# Altium project NeoLink Basic Main Board.PrjPcb (part 1 of 2)
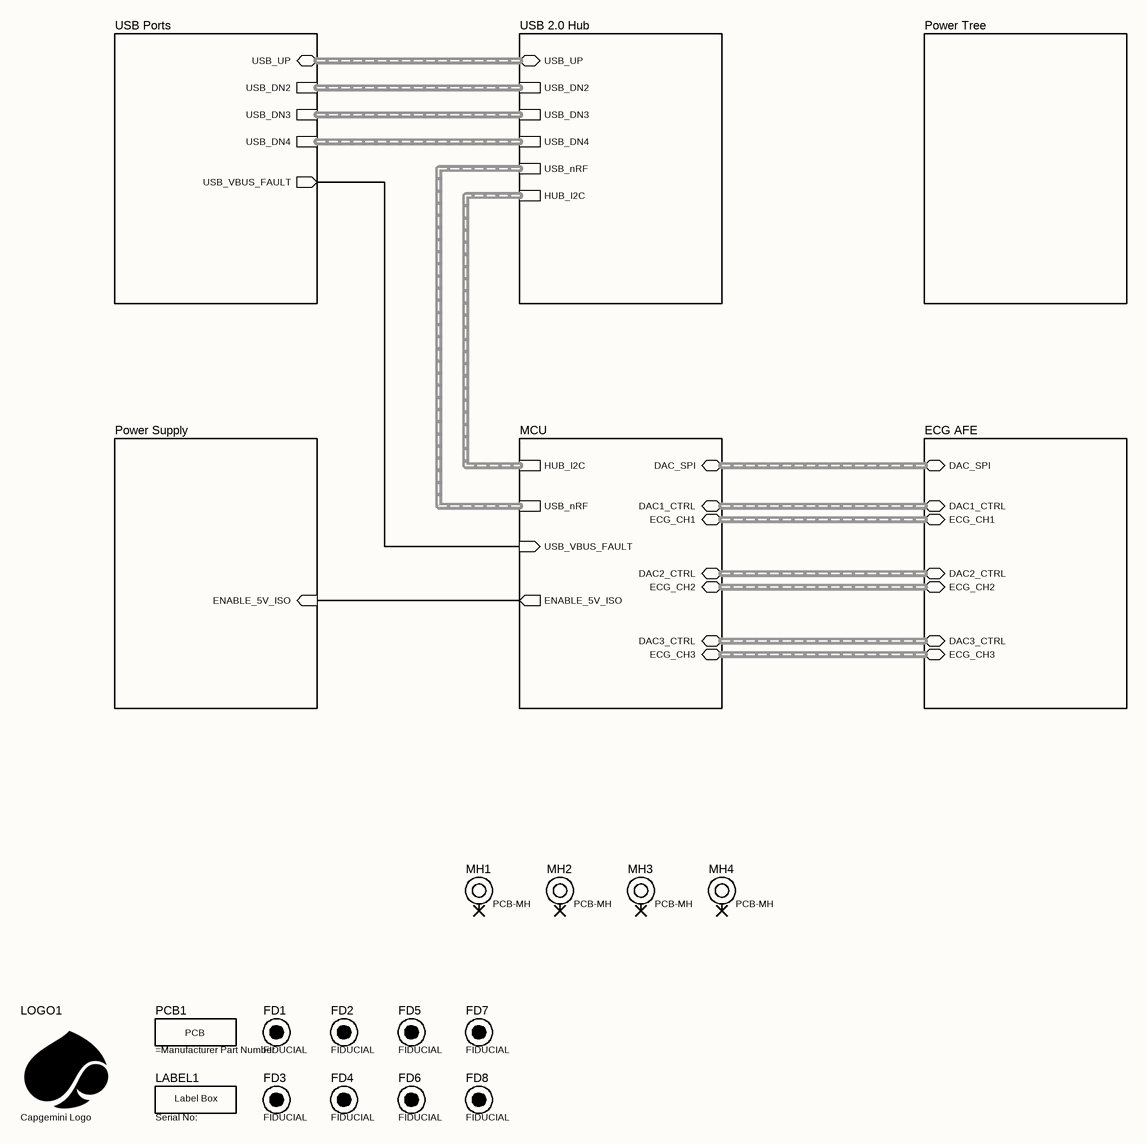
[diagram p0: NeoLink Basic Main Board - Top Level.SchDoc]
AuthorInitials: ASH; CGProjectName: NeoLink Basic; ClientName: VITALTRACE PTY LTD; PCBANo: 7001; PCBARev: 05; PCBNo: 7000; PCBRev: 05; ProjectCode: VIT-2679; ProjectTitle: NeoLink Basic Main Board
8 sheets, 468 parts. Net scope: hierarchical (ports join the sheet entries above them; power ports are global).
Board file: NeoLink Basic Main Board.PcbDoc
Sheets:
  NeoLink Basic Main Board - Top Level.SchDoc
    USB 2.0 Hub = USB 2.0 Hub.SchDoc
    Power Supply = Power Supply.SchDoc
    USB Ports = USB Ports.SchDoc
    MCU = MCU.SchDoc
    ECG AFE = ECG AFE.SchDoc
      A = AFE Channel.SchDoc
      B = AFE Channel.SchDoc
      C = AFE Channel.SchDoc
    Power Tree = Power Tree.SchDoc

## Sheet NeoLink Basic Main Board - Top Level.SchDoc: Top Level
size A3; DocumentNumber: 1; SheetNumber: 1; SheetTotal: 9

### Parts
FD1  FIDUCIAL  [FIDUCIAL-1MM]  (no BOM)
FD2  FIDUCIAL  [FIDUCIAL-1MM]  (no BOM)
FD3  FIDUCIAL  [FIDUCIAL-1MM]  (no BOM)
FD4  FIDUCIAL  [FIDUCIAL-1MM]  (no BOM)
FD5  FIDUCIAL  [FIDUCIAL-1MM]  (no BOM)
FD6  FIDUCIAL  [FIDUCIAL-1MM]  (no BOM)
FD7  FIDUCIAL  [FIDUCIAL-1MM]  (no BOM)
FD8  FIDUCIAL  [FIDUCIAL-1MM]  (no BOM)
LABEL1  Serial No:  [Label Box, Rectangle, 6mm x 20mm]  (no BOM)
LOGO1  Capgemini Logo  [Capgemini Copper Logo - Large]  (no BOM)
MH1  PCB-MH  [PCB-MH-M3-LF-PH]  (no BOM)
MH2  PCB-MH  [PCB-MH-M3-LF-PH]  (no BOM)
MH3  PCB-MH  [PCB-MH-M3-LF-PH]  (no BOM)
MH4  PCB-MH  [PCB-MH-M3-LF-PH]  (no BOM)
PCB1  (no value)  (mechanical)

### Sub-sheets
ECG AFE = ECG AFE.SchDoc: DAC_SPI (bidir, harness DAC_SPI), DAC1_CTRL (bidir, harness DAC_SPI), DAC2_CTRL (bidir, harness DAC_SPI), DAC3_CTRL (bidir, harness DAC_SPI), ECG_CH1 (bidir, harness ECG_CH1), ECG_CH2 (bidir, harness ECG_CH1), ECG_CH3 (bidir, harness ECG_CH1)
MCU = MCU.SchDoc: DAC_SPI (bidir, harness DAC_SPI), DAC1_CTRL (bidir, harness DAC_SPI), DAC2_CTRL (bidir, harness DAC_SPI), DAC3_CTRL (bidir, harness DAC_SPI), ECG_CH1 (bidir, harness ECG_CH1), ECG_CH2 (bidir, harness ECG_CH1), ECG_CH3 (bidir, harness ECG_CH1), USB_nRF (harness USB_nRF), HUB_I2C (harness HUB_I2C), USB_VBUS_FAULT (in), ENABLE_5V_ISO (out)
Power Supply = Power Supply.SchDoc: ENABLE_5V_ISO (in)
Power Tree = Power Tree.SchDoc: no entries
USB 2.0 Hub = USB 2.0 Hub.SchDoc: USB_DN2 (harness USB_DN2), USB_DN3 (harness USB_DN3), USB_DN4 (harness USB_DN4), USB_UP (bidir, harness USB_UP), USB_nRF (harness USB_nRF), HUB_I2C (harness HUB_I2C)
USB Ports = USB Ports.SchDoc: USB_DN2 (harness USB_DN2), USB_DN3 (harness USB_DN3), USB_DN4 (harness USB_DN4), USB_UP (bidir, harness USB_UP), USB_VBUS_FAULT (out)

### Nets
ENABLE_5V_ISO: sheet Power Supply/ENABLE_5V_ISO, sheet MCU/ENABLE_5V_ISO
USB_VBUS_FAULT: sheet USB Ports/USB_VBUS_FAULT, sheet MCU/USB_VBUS_FAULT

Not connected (* = marked no-connect by the designer): MH1 MH*; MH2 MH*; MH3 MH*; MH4 MH*

### Buses and harness runs
harness sheet ECG AFE/DAC1_CTRL = sheet MCU/DAC1_CTRL
harness sheet ECG AFE/DAC2_CTRL = sheet MCU/DAC2_CTRL
harness sheet ECG AFE/DAC3_CTRL = sheet MCU/DAC3_CTRL
harness sheet ECG AFE/DAC_SPI = sheet MCU/DAC_SPI
harness sheet ECG AFE/ECG_CH1 = sheet MCU/ECG_CH1
harness sheet ECG AFE/ECG_CH2 = sheet MCU/ECG_CH2
harness sheet ECG AFE/ECG_CH3 = sheet MCU/ECG_CH3
harness sheet MCU/HUB_I2C = sheet USB 2.0 Hub/HUB_I2C
harness sheet MCU/USB_nRF = sheet USB 2.0 Hub/USB_nRF
harness sheet USB 2.0 Hub/USB_DN2 = sheet USB Ports/USB_DN2
harness sheet USB 2.0 Hub/USB_DN3 = sheet USB Ports/USB_DN3
harness sheet USB 2.0 Hub/USB_DN4 = sheet USB Ports/USB_DN4
harness sheet USB 2.0 Hub/USB_UP = sheet USB Ports/USB_UP

### Notes on the sheet
- COMMERCIAL IN CONFIDENCE
- CLIENT
- THIS DOCUMENT IS UNCONTROLLED WHEN PRINTED
- PROJECT
- PART NAME
- TITLE
- SHEET SIZE
- SHEET
- DATE
- A3
- FILE
- PROJECT CODE
- PART / DWG No.
- REV
- VARIANT
- AUTHOR
- (in symbol CMP-0000003197-1) PCB

### Library data of the parts
FD1-FD8 = CMP-0000000671-3
LABEL1 = CMP-0000002854-5: Manufacturer: N/A; Manufacturer Part Number: N/A
LOGO1 = CMP-0000003196-9: Manufacturer: N/A; Manufacturer Part Number: N/A
MH1-MH4 = CMP-0000002988-3
PCB1 = CMP-0000003197-1: Capgemini PCB BOM Component; Manufacturer Part Number: VIT-2679-7000-05; Manufacturer: VITALTRACE PTY LTD

## Sheet USB 2.0 Hub.SchDoc: USB 2.0 Hub
size A2; DocumentNumber: 5; SheetNumber: 5; SheetTotal: 9
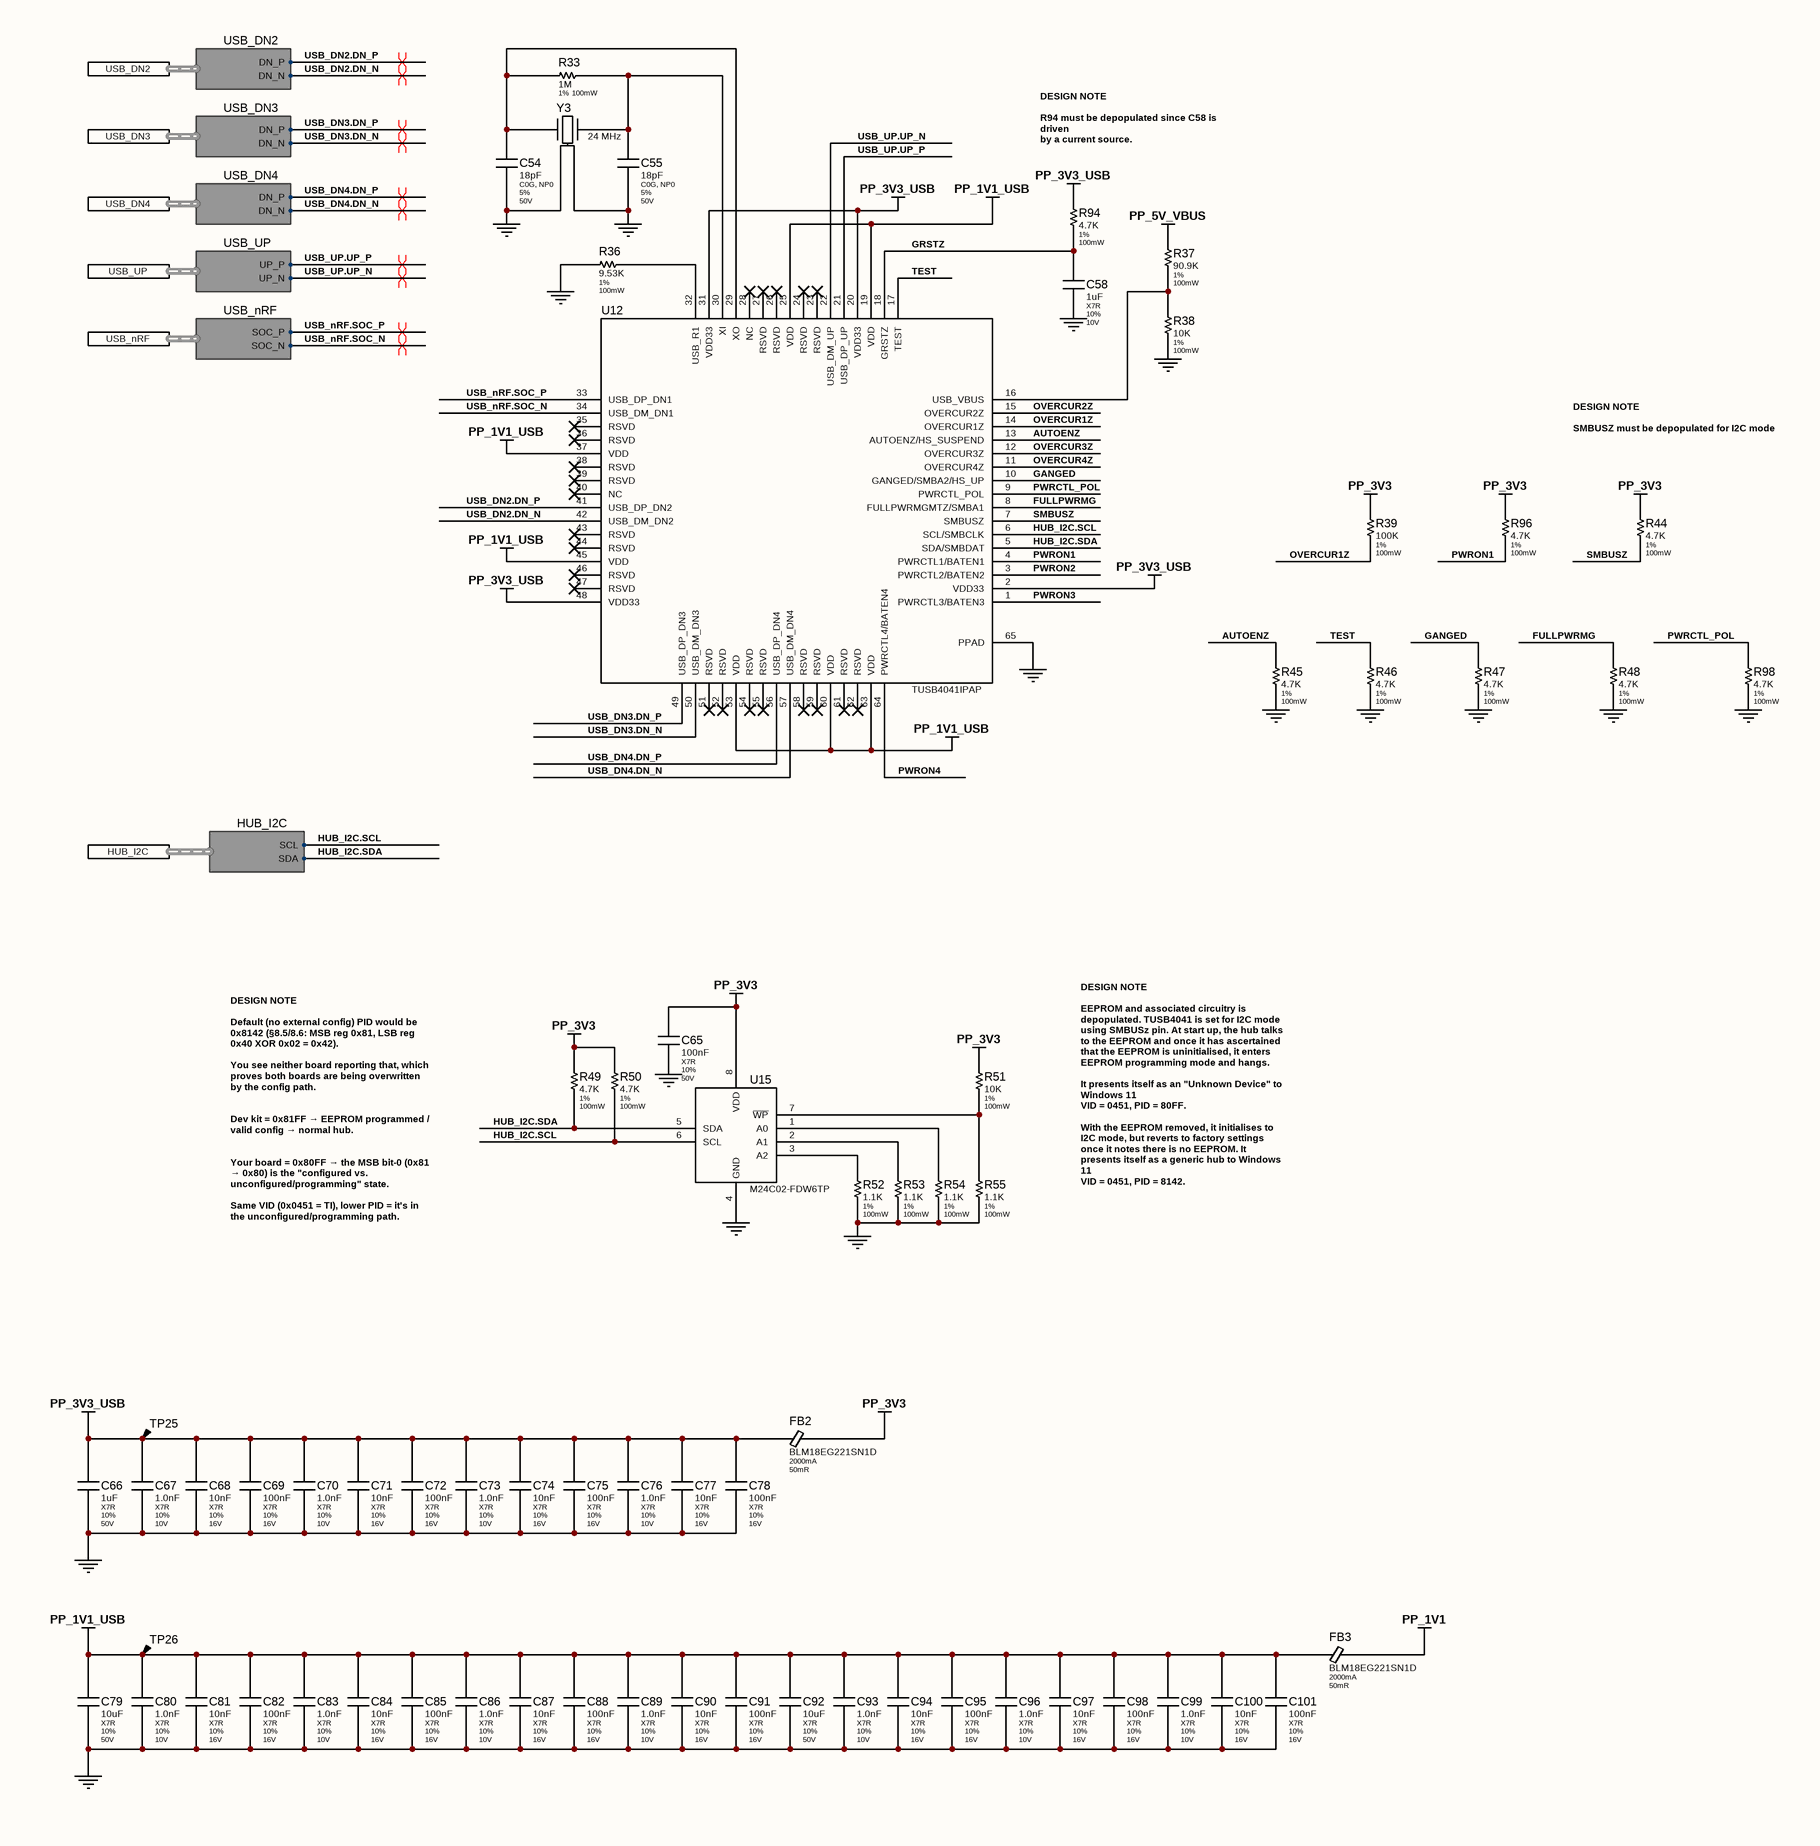
[diagram p1: USB 2.0 Hub.SchDoc, left]
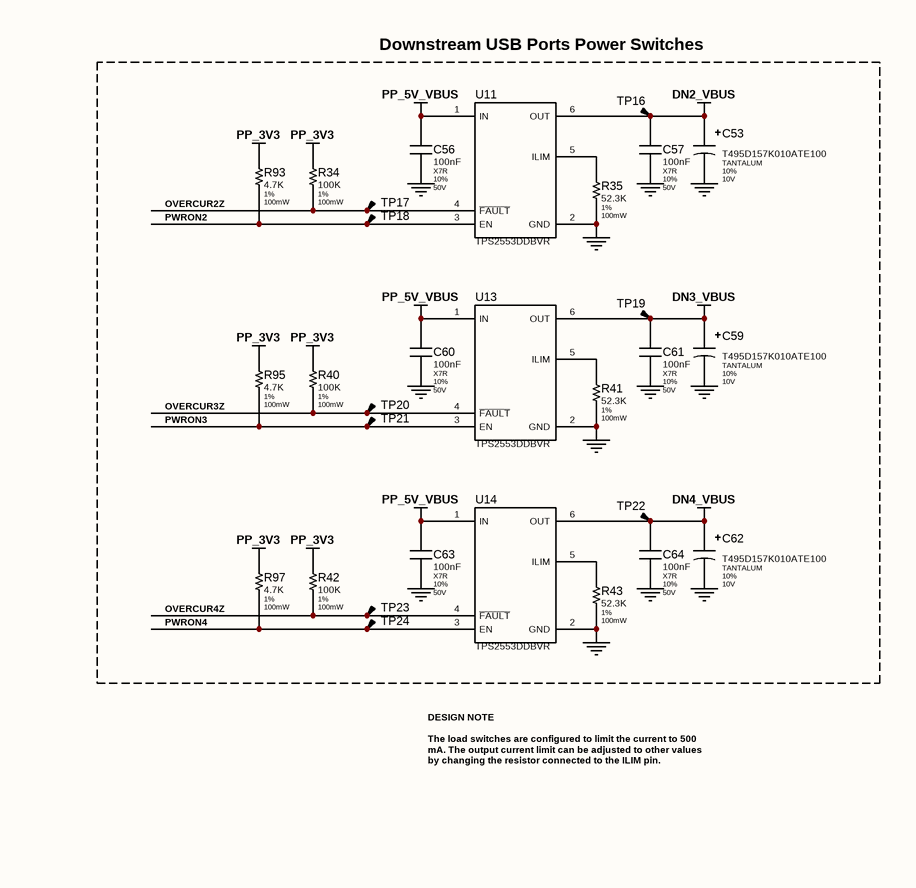
[diagram p2: USB 2.0 Hub.SchDoc, right]

### Parts
C53  T495D157K010ATE100  Type: TANTALUM  Tolerance: 10%  Voltage: 10V  [T495D]
C54  18pF  Dielectric: C0G, NP0  Tolerance: 5%  Voltage: 50V  [MLCC-0402-N]
C55  18pF  Dielectric: C0G, NP0  Tolerance: 5%  Voltage: 50V  [MLCC-0402-N]
C56  100nF  Dielectric: X7R  Tolerance: 10%  Voltage: 50V  [MLCC-0402-N]
C57  100nF  Dielectric: X7R  Tolerance: 10%  Voltage: 50V  [MLCC-0402-N]
C58  1uF  Dielectric: X7R  Tolerance: 10%  Voltage: 10V  [MLCC-0402-N]
C59  T495D157K010ATE100  Type: TANTALUM  Tolerance: 10%  Voltage: 10V  [T495D]
C60  100nF  Dielectric: X7R  Tolerance: 10%  Voltage: 50V  [MLCC-0402-N]
C61  100nF  Dielectric: X7R  Tolerance: 10%  Voltage: 50V  [MLCC-0402-N]
C62  T495D157K010ATE100  Type: TANTALUM  Tolerance: 10%  Voltage: 10V  [T495D]
C63  100nF  Dielectric: X7R  Tolerance: 10%  Voltage: 50V  [MLCC-0402-N]
C64  100nF  Dielectric: X7R  Tolerance: 10%  Voltage: 50V  [MLCC-0402-N]
C65  100nF  Dielectric: X7R  Tolerance: 10%  Voltage: 50V  [MLCC-0402-N]
C66  1uF  Dielectric: X7R  Tolerance: 10%  Voltage: 50V  [MLCC-0805-N]
C67  1.0nF  Dielectric: X7R  Tolerance: 10%  Voltage: 10V  [MLCC-0201-N]
C68  10nF  Dielectric: X7R  Tolerance: 10%  Voltage: 16V  [MLCC-0201-N]
C69  100nF  Dielectric: X7R  Tolerance: 10%  Voltage: 16V  [MLCC-0201-N]
C70  1.0nF  Dielectric: X7R  Tolerance: 10%  Voltage: 10V  [MLCC-0201-N]
C71  10nF  Dielectric: X7R  Tolerance: 10%  Voltage: 16V  [MLCC-0201-N]
C72  100nF  Dielectric: X7R  Tolerance: 10%  Voltage: 16V  [MLCC-0201-N]
C73  1.0nF  Dielectric: X7R  Tolerance: 10%  Voltage: 10V  [MLCC-0201-N]
C74  10nF  Dielectric: X7R  Tolerance: 10%  Voltage: 16V  [MLCC-0201-N]
C75  100nF  Dielectric: X7R  Tolerance: 10%  Voltage: 16V  [MLCC-0201-N]
C76  1.0nF  Dielectric: X7R  Tolerance: 10%  Voltage: 10V  [MLCC-0201-N]
C77  10nF  Dielectric: X7R  Tolerance: 10%  Voltage: 16V  [MLCC-0201-N]
C78  100nF  Dielectric: X7R  Tolerance: 10%  Voltage: 16V  [MLCC-0201-N]
C79  10uF  Dielectric: X7R  Tolerance: 10%  Voltage: 50V  [MLCC-1206-N]
C80  1.0nF  Dielectric: X7R  Tolerance: 10%  Voltage: 10V  [MLCC-0201-N]
C81  10nF  Dielectric: X7R  Tolerance: 10%  Voltage: 16V  [MLCC-0201-N]
C82  100nF  Dielectric: X7R  Tolerance: 10%  Voltage: 16V  [MLCC-0201-N]
C83  1.0nF  Dielectric: X7R  Tolerance: 10%  Voltage: 10V  [MLCC-0201-N]
C84  10nF  Dielectric: X7R  Tolerance: 10%  Voltage: 16V  [MLCC-0201-N]
C85  100nF  Dielectric: X7R  Tolerance: 10%  Voltage: 16V  [MLCC-0201-N]
C86  1.0nF  Dielectric: X7R  Tolerance: 10%  Voltage: 10V  [MLCC-0201-N]
C87  10nF  Dielectric: X7R  Tolerance: 10%  Voltage: 16V  [MLCC-0201-N]
C88  100nF  Dielectric: X7R  Tolerance: 10%  Voltage: 16V  [MLCC-0201-N]
C89  1.0nF  Dielectric: X7R  Tolerance: 10%  Voltage: 10V  [MLCC-0201-N]
C90  10nF  Dielectric: X7R  Tolerance: 10%  Voltage: 16V  [MLCC-0201-N]
C91  100nF  Dielectric: X7R  Tolerance: 10%  Voltage: 16V  [MLCC-0201-N]
C92  10uF  Dielectric: X7R  Tolerance: 10%  Voltage: 50V  [MLCC-1206-N]
C93  1.0nF  Dielectric: X7R  Tolerance: 10%  Voltage: 10V  [MLCC-0201-N]
C94  10nF  Dielectric: X7R  Tolerance: 10%  Voltage: 16V  [MLCC-0201-N]
C95  100nF  Dielectric: X7R  Tolerance: 10%  Voltage: 16V  [MLCC-0201-N]
C96  1.0nF  Dielectric: X7R  Tolerance: 10%  Voltage: 10V  [MLCC-0201-N]
C97  10nF  Dielectric: X7R  Tolerance: 10%  Voltage: 16V  [MLCC-0201-N]
C98  100nF  Dielectric: X7R  Tolerance: 10%  Voltage: 16V  [MLCC-0201-N]
C99  1.0nF  Dielectric: X7R  Tolerance: 10%  Voltage: 10V  [MLCC-0201-N]
C100  10nF  Dielectric: X7R  Tolerance: 10%  Voltage: 16V  [MLCC-0201-N]
C101  100nF  Dielectric: X7R  Tolerance: 10%  Voltage: 16V  [MLCC-0201-N]
FB2  BLM18EG221SN1D  Current: 2000mA  ESR: 50mR  [FB-0603-N]
FB3  BLM18EG221SN1D  Current: 2000mA  ESR: 50mR  [FB-0603-N]
R33  1M  Tolerance: 1%  Power: 100mW  [RES-0402-N]
R34  100K  Tolerance: 1%  Power: 100mW  [RES-0402-N]
R35  52.3K  Tolerance: 1%  Power: 100mW  [RES-0402-N]
R36  9.53K  Tolerance: 1%  Power: 100mW  [RES-0402-N]
R37  90.9K  Tolerance: 1%  Power: 100mW  [RES-0402-N]
R38  10K  Tolerance: 1%  Power: 100mW  [RES-0402-N]
R39  100K  Tolerance: 1%  Power: 100mW  [RES-0402-N]
R40  100K  Tolerance: 1%  Power: 100mW  [RES-0402-N]
R41  52.3K  Tolerance: 1%  Power: 100mW  [RES-0402-N]
R42  100K  Tolerance: 1%  Power: 100mW  [RES-0402-N]
R43  52.3K  Tolerance: 1%  Power: 100mW  [RES-0402-N]
R44  4.7K  Tolerance: 1%  Power: 100mW  [RES-0402-N]
R45  4.7K  Tolerance: 1%  Power: 100mW  [RES-0402-N]
R46  4.7K  Tolerance: 1%  Power: 100mW  [RES-0402-N]
R47  4.7K  Tolerance: 1%  Power: 100mW  [RES-0402-N]
R48  4.7K  Tolerance: 1%  Power: 100mW  [RES-0402-N]
R49  4.7K  Tolerance: 1%  Power: 100mW  [RES-0402-N]
R50  4.7K  Tolerance: 1%  Power: 100mW  [RES-0402-N]
R51  10K  Tolerance: 1%  Power: 100mW  [RES-0402-N]
R52  1.1K  Tolerance: 1%  Power: 100mW  [RES-0402-N]
R53  1.1K  Tolerance: 1%  Power: 100mW  [RES-0402-N]
R54  1.1K  Tolerance: 1%  Power: 100mW  [RES-0402-N]
R55  1.1K  Tolerance: 1%  Power: 100mW  [RES-0402-N]  (no BOM)
R93  4.7K  Tolerance: 1%  Power: 100mW  [RES-0402-N]
R94  4.7K  Tolerance: 1%  Power: 100mW  [RES-0402-N]  (no BOM)
R95  4.7K  Tolerance: 1%  Power: 100mW  [RES-0402-N]
R96  4.7K  Tolerance: 1%  Power: 100mW  [RES-0402-N]
R97  4.7K  Tolerance: 1%  Power: 100mW  [RES-0402-N]
R98  4.7K  Tolerance: 1%  Power: 100mW  [RES-0402-N]  (no BOM)
TP16  TP-SMT-CIRCLE  [TP-1.0mm]  (value not drawn)  (no BOM)
TP17  TP-SMT-CIRCLE  [TP-1.0mm]  (value not drawn)  (no BOM)
TP18  TP-SMT-CIRCLE  [TP-1.0mm]  (value not drawn)  (no BOM)
TP19  TP-SMT-CIRCLE  [TP-1.0mm]  (value not drawn)  (no BOM)
TP20  TP-SMT-CIRCLE  [TP-1.0mm]  (value not drawn)  (no BOM)
TP21  TP-SMT-CIRCLE  [TP-1.0mm]  (value not drawn)  (no BOM)
TP22  TP-SMT-CIRCLE  [TP-1.0mm]  (value not drawn)  (no BOM)
TP23  TP-SMT-CIRCLE  [TP-1.0mm]  (value not drawn)  (no BOM)
TP24  TP-SMT-CIRCLE  [TP-1.0mm]  (value not drawn)  (no BOM)
TP25  TP-SMT-CIRCLE  [TP-1.0mm]  (value not drawn)  (no BOM)
TP26  TP-SMT-CIRCLE  [TP-1.0mm]  (value not drawn)  (no BOM)
U11  TPS2553DDBVR  [SOT95P280X145-6N]
U12  TUSB4041IPAP  [PAP0064M]
U13  TPS2553DDBVR  [SOT95P280X145-6N]
U14  TPS2553DDBVR  [SOT95P280X145-6N]
U15  M24C02-FDW6TP  [TSSOP-8-N]
Y3  24 MHz  [XTAL-5.0x3.2-ECS]

### Blocks framed on the sheet
Downstream USB Ports Power Switches: C53 C56 C57 C59-C64 R34 R35 R40-R43 R93 R95 R97 TP16-TP24 U11 U13 U14

### Ports
HUB_I2C (harness HUB_I2C), USB_DN2 (harness USB_DN2), USB_DN3 (harness USB_DN3), USB_DN4 (harness USB_DN4), USB_nRF (harness USB_nRF), USB_UP (harness USB_UP)

### Harnesses
USB_DN2: DN_P, DN_N
USB_DN3: DN_P, DN_N
USB_DN4: DN_P, DN_N
USB_UP: UP_P, UP_N
USB_nRF: SOC_P, SOC_N
HUB_I2C: SCL, SDA

### Nets
DN2_VBUS: C53.1 C57.1 TP16.1 U11.6(OUT)
DN3_VBUS: C59.1 C61.1 TP19.1 U13.6(OUT)
DN4_VBUS: C62.1 C64.1 TP22.1 U14.6(OUT)
GND: C53.2 C54.2 C55.2 C56.2 C57.2 C58.2 C59.2 C60.2 C61.2 C62.2 C63.2 C64.2 C65.2 C66.2 C67.2 C68.2 C69.2 C70.2 C71.2 C72.2 C73.2 C74.2 C75.2 C76.2 C77.2 C78.2 C79.2 C80.2 C81.2 C82.2 C83.2 C84.2 C85.2 C86.2 C87.2 C88.2 C89.2 C90.2 C91.2 C92.2 C93.2 C94.2 C95.2 C96.2 C97.2 C98.2 C99.2 C100.2 C101.2 R35.2 R36.1 R38.2 R41.2 R43.2 R45.2 R46.2 R47.2 R48.2 R52.2 R53.2 R54.2 R55.2 R98.2 U11.2(GND) U12.65(PPAD) U13.2(GND) U14.2(GND) U15.4(GND) Y3.2 Y3.4
PP_1V1: FB3.2
PP_1V1_USB: C79.1 C80.1 C81.1 C82.1 C83.1 C84.1 C85.1 C86.1 C87.1 C88.1 C89.1 C90.1 C91.1 C92.1 C93.1 C94.1 C95.1 C96.1 C97.1 C98.1 C99.1 C100.1 C101.1 FB3.1 TP26.1 U12.19(VDD) U12.25(VDD) U12.37(VDD) U12.45(VDD) U12.53(VDD) U12.60(VDD) U12.63(VDD)
PP_3V3: C65.1 FB2.2 R34.1 R39.1 R40.1 R42.1 R44.1 R49.1 R50.1 R51.1 R93.1 R95.1 R96.1 R97.1 U15.8(VDD)
PP_3V3_USB: C66.1 C67.1 C68.1 C69.1 C70.1 C71.1 C72.1 C73.1 C74.1 C75.1 C76.1 C77.1 C78.1 FB2.1 R94.1 TP25.1 U12.2(VDD33) U12.20(VDD33) U12.31(VDD33) U12.48(VDD33)
PP_5V_VBUS: C56.1 C60.1 C63.1 R37.2 U11.1(IN) U13.1(IN) U14.1(IN)
AUTOENZ: R45.1 U12.13(AUTOENZ/HS_SUSPEND)
FULLPWRMG: R48.1 U12.8(FULLPWRMGMTZ/SMBA1)
GANGED: R47.1 U12.10(GANGED/SMBA2/HS_UP)
GRSTZ: C58.1 R94.2 U12.18(GRSTZ)
HUB_I2C.SCL: R50.2 U12.6(SCL/SMBCLK) U15.6(SCL) ; port HUB_I2C.SCL
HUB_I2C.SDA: R49.2 U12.5(SDA/SMBDAT) U15.5(SDA) ; port HUB_I2C.SDA
OVERCUR1Z: R39.2 U12.14(OVERCUR1Z)
OVERCUR2Z: R34.2 TP17.1 U11.4(~{FAULT}) U12.15(OVERCUR2Z)
OVERCUR3Z: R40.2 TP20.1 U12.12(OVERCUR3Z) U13.4(~{FAULT})
OVERCUR4Z: R42.2 TP23.1 U12.11(OVERCUR4Z) U14.4(~{FAULT})
PWRCTL_POL: R98.1 U12.9(PWRCTL_POL)
PWRON1: R96.2 U12.4(PWRCTL1/BATEN1)
PWRON2: R93.2 TP18.1 U11.3(EN) U12.3(PWRCTL2/BATEN2)
PWRON3: R95.2 TP21.1 U12.1(PWRCTL3/BATEN3) U13.3(EN)
PWRON4: R97.2 TP24.1 U12.64(PWRCTL4/BATEN4) U14.3(EN)
SMBUSZ: R44.2 U12.7(SMBUSZ)
TEST: R46.1 U12.17(TEST)
USB_DN2.DN_N: U12.42(USB_DM_DN2) ; port USB_DN2.DN_N
USB_DN2.DN_P: U12.41(USB_DP_DN2) ; port USB_DN2.DN_P
USB_DN3.DN_N: U12.50(USB_DM_DN3) ; port USB_DN3.DN_N
USB_DN3.DN_P: U12.49(USB_DP_DN3) ; port USB_DN3.DN_P
USB_DN4.DN_N: U12.57(USB_DM_DN4) ; port USB_DN4.DN_N
USB_DN4.DN_P: U12.56(USB_DP_DN4) ; port USB_DN4.DN_P
USB_nRF.SOC_N: U12.34(USB_DM_DN1) ; port USB_nRF.SOC_N
USB_nRF.SOC_P: U12.33(USB_DP_DN1) ; port USB_nRF.SOC_P
USB_UP.UP_N: U12.22(USB_DM_UP) ; port USB_UP.UP_N
USB_UP.UP_P: U12.21(USB_DP_UP) ; port USB_UP.UP_P
NetC54_1: C54.1 R33.1 U12.29(XO) Y3.1
NetC55_1: C55.1 R33.2 U12.30(XI) Y3.3
NetR35_1: R35.1 U11.5(ILIM)
NetR36_2: R36.2 U12.32(USB_R1)
NetR37_1: R37.1 R38.1 U12.16(USB_VBUS)
NetR41_1: R41.1 U13.5(ILIM)
NetR43_1: R43.1 U14.5(ILIM)
NetR51_2: R51.2 R55.1 U15.7(~{WP})
NetR52_1: R52.1 U15.3(A2)
NetR53_1: R53.1 U15.2(A1)
NetR54_1: R54.1 U15.1(A0)

Not connected (* = marked no-connect by the designer): U12 23(RSVD)* 24(RSVD)* 26(RSVD)* 27(RSVD)* 28(NC)* 35(RSVD)* 36(RSVD)* 38(RSVD)* 39(RSVD)* 40(NC)* 43(RSVD)* 44(RSVD)* 46(RSVD)* 47(RSVD)* 51(RSVD)* 52(RSVD)* 54(RSVD)* 55(RSVD)* 58(RSVD)* 59(RSVD)* 61(RSVD)* 62(RSVD)*

### Layout directives
differential pair: USB_DN2.DN_N, USB_DN2.DN_P, USB_DN3.DN_N, USB_DN3.DN_P, USB_DN4.DN_N, USB_DN4.DN_P, USB_nRF.SOC_N, USB_nRF.SOC_P, USB_UP.UP_N, USB_UP.UP_P

### Notes on the sheet
- DESIGN NOTE
  R94 must be depopulated since C58 is driven
  by a current source.
- DESIGN NOTE
  SMBUSZ must be depopulated for I2C mode
- DESIGN NOTE
  The load switches are configured to limit the current to 500 mA. The output current limit can be adjusted to other values by changing the resistor connected to the ILIM pin.
- DESIGN NOTE
  Default (no external config) PID would be 0x8142 (§8.5/8.6: MSB reg 0x81, LSB reg 0x40 XOR 0x02 = 0x42).
  You see neither board reporting that, which proves both boards are being overwritten by the config path.
  Dev kit = 0x81FF → EEPROM programmed / valid config → normal hub.
  Your board = 0x80FF → the MSB bit‑0 (0x81 → 0x80) is the "configured vs. unconfigured/programming" state.
  Same VID (0x0451 = TI), lower PID = it's in the unconfigured/programming path.
- DESIGN NOTE
  EEPROM and associated circuitry is depopulated. TUSB4041 is set for I2C mode using SMBUSz pin. At start up, the hub talks to the EEPROM and once it has ascertained that the EEPROM is uninitialised, it enters EEPROM programming mode and hangs.
  It presents itself as an "Unknown Device" to Windows 11
  VID = 0451, PID = 80FF.
  With the EEPROM removed, it initialises to I2C mode, but reverts to factory settings once it notes there is no EEPROM. It presents itself as a generic hub to Windows 11
  VID = 0451, PID = 8142.
- THIS DOCUMENT IS UNCONTROLLED WHEN PRINTED
- COMMERCIAL IN CONFIDENCE
- CLIENT
- PROJECT
- PART NAME
- TITLE
- SHEET SIZE
- SHEET
- DATE
- A2
- FILE
- PROJECT CODE
- PART / DWG No.
- REV
- VARIANT
- AUTHOR

### Library data of the parts
C53 C59 C62 = CMP-0000003482-3: CAP-TANT-150uF-10V-10%-2917; Manufacturer: KEMET; Value: 150uF; Temperature (Min): -55; ESR: 100 mOhm; Temperature (Max): 125; ComponentLink1Description: Datasheet; ComponentLink1URL: https://yageogroup.com/content/datasheet/asset/file/KEM_T2009_T495; Manufacturer Part Number: T495D157K010ATE100
C54 C55 = CMP-0000000730-3: CAP-CER-18pF-50V-0402-NP0-5%; Value: 18pF
C56 C57 C60 C61 C63-C65 = CMP-0000000712-3: CAP-CER-100nF-50V-0402-X7R-10%; Value: 100nF
C58 = CMP-0000002778-1: CAP-CER-1uF-10V-0402-X7R-10%; Value: 1uF
C66 = CMP-0000001064-2: CAP-CER-1uF-50V-0805-X7R-10%; Value: 1uF
C67 C70 C73 C76 C80 C83 C86 C89 C93 C96 C99 = CMP-0000003428-2: CAP-CER-1.0nF-10V-0201-X7R-10%; Value: 1.0nF
C68 C71 C74 C77 C81 C84 C87 C90 C94 C97 C100 = CMP-0000003392-1: CAP-CER-10nF-16V-0201-X7R-10%; Value: 10nF
C69 C72 C75 C78 C82 C85 C88 C91 C95 C98 C101 = CMP-0000003381-1: CAP-CER-100nF-16V-0201-X7R-10%; Value: 100nF
C79 C92 = CMP-0000002231-1: CAP-CER-10uF-50V-1206-X7R-10%; Value: 10uF
FB2 FB3 = CMP-00084-3: FB-220R@100MHz-2000mA-50mR-BLM18EG221SN1D; Manufacturer: Murata Electronics; Value: 220 Ohms @ 100MHz; Tolerance: 25%; ComponentLink1Description: Datasheet; Manufacturer Part Number: BLM18EG221SN1D; ComponentLink1URL: https://www.murata.com/en-us/products/productdata/8796747366430/ENFA0021.pdf
R33 = CMP-0000001837-2: RES-1M-0402-1%-100mW; Value: 1M
R34 R39 R40 R42 = CMP-0000001723-1: RES-100K-0402-1%-100mW; Value: 100K
R35 R41 R43 = CMP-0000001691-1: RES-52.3K-0402-1%-100mW; Value: 52.3K
R36 = CMP-0000001607-1: RES-9.53K-0402-1%-100mW; Value: 9.53K
R37 = CMP-0000001718-1: RES-90.9K-0402-1%-100mW; Value: 90.9K
R38 R51 = CMP-0000001609-1: RES-10K-0402-1%-100mW; Value: 10K
R44-R50 R93-R98 = CMP-0000001571-1: RES-4.7K-0402-1%-100mW; Value: 4.7K
R52-R55 = CMP-0000001499-1: RES-1.1K-0402-1%-100mW; Value: 1.1K
TP16-TP26 = CMP-0000000822-22: Test Point, Circular SMT Style
U11 U13 U14 = CMP-0000003472-2: IC-PWRSWITCH-1.5A-TPS2553DDBVR; Manufacturer: Texas Instruments; ComponentLink1Description: Datasheet; Manufacturer Part Number: TPS2553DDBVR; ComponentLink1URL: https://www.ti.com/general/docs/suppproductinfo.tsp?distId=10&gotoUrl=https%3A%2F%2Fwww.ti.com%2Flit%2Fgpn%2Ftps2552d
U12 = CMP-0000003455-3: IC-INTERFACE-USB-HUB-TUSB4041IPAP; Manufacturer: Texas Instruments; Manufacturer Part Number: TUSB4041IPAP; ComponentLink1URL: https://www.ti.com/lit/gpn/tusb4041i; ComponentLink1Description: Datasheet
U15 = CMP-0000002330-2: IC-EEPROM-2KBIT-M24C02-FDW6TP; Manufacturer: STMicroelectronics; ComponentLink1URL: https://www.st.com/content/ccc/resource/technical/document/datasheet/b0/d8/50/40/5a/85/49/6f/DM00071904.pdf/files/DM00071904.pdf/jcr:content/translations/en.DM00071904.pdf; Manufacturer Part Number: M24C02-FDW6TP; ComponentLink1Description: Datasheet
Y3 = CMP-00287-2: XTAL-24MHz-50ppm-20pF-5.0x3.2; Manufacturer: ECS Inc.; Manufacturer Part Number: ECS-240-20-30B-TR; Stability: ±50ppm; Load Capacitance: 20pF; Tolerance: ±10ppm; Value: 24 MHz

## Sheet Power Supply.SchDoc: Power Supply
size A3; DocumentNumber: 3; SheetNumber: 3; SheetTotal: 9
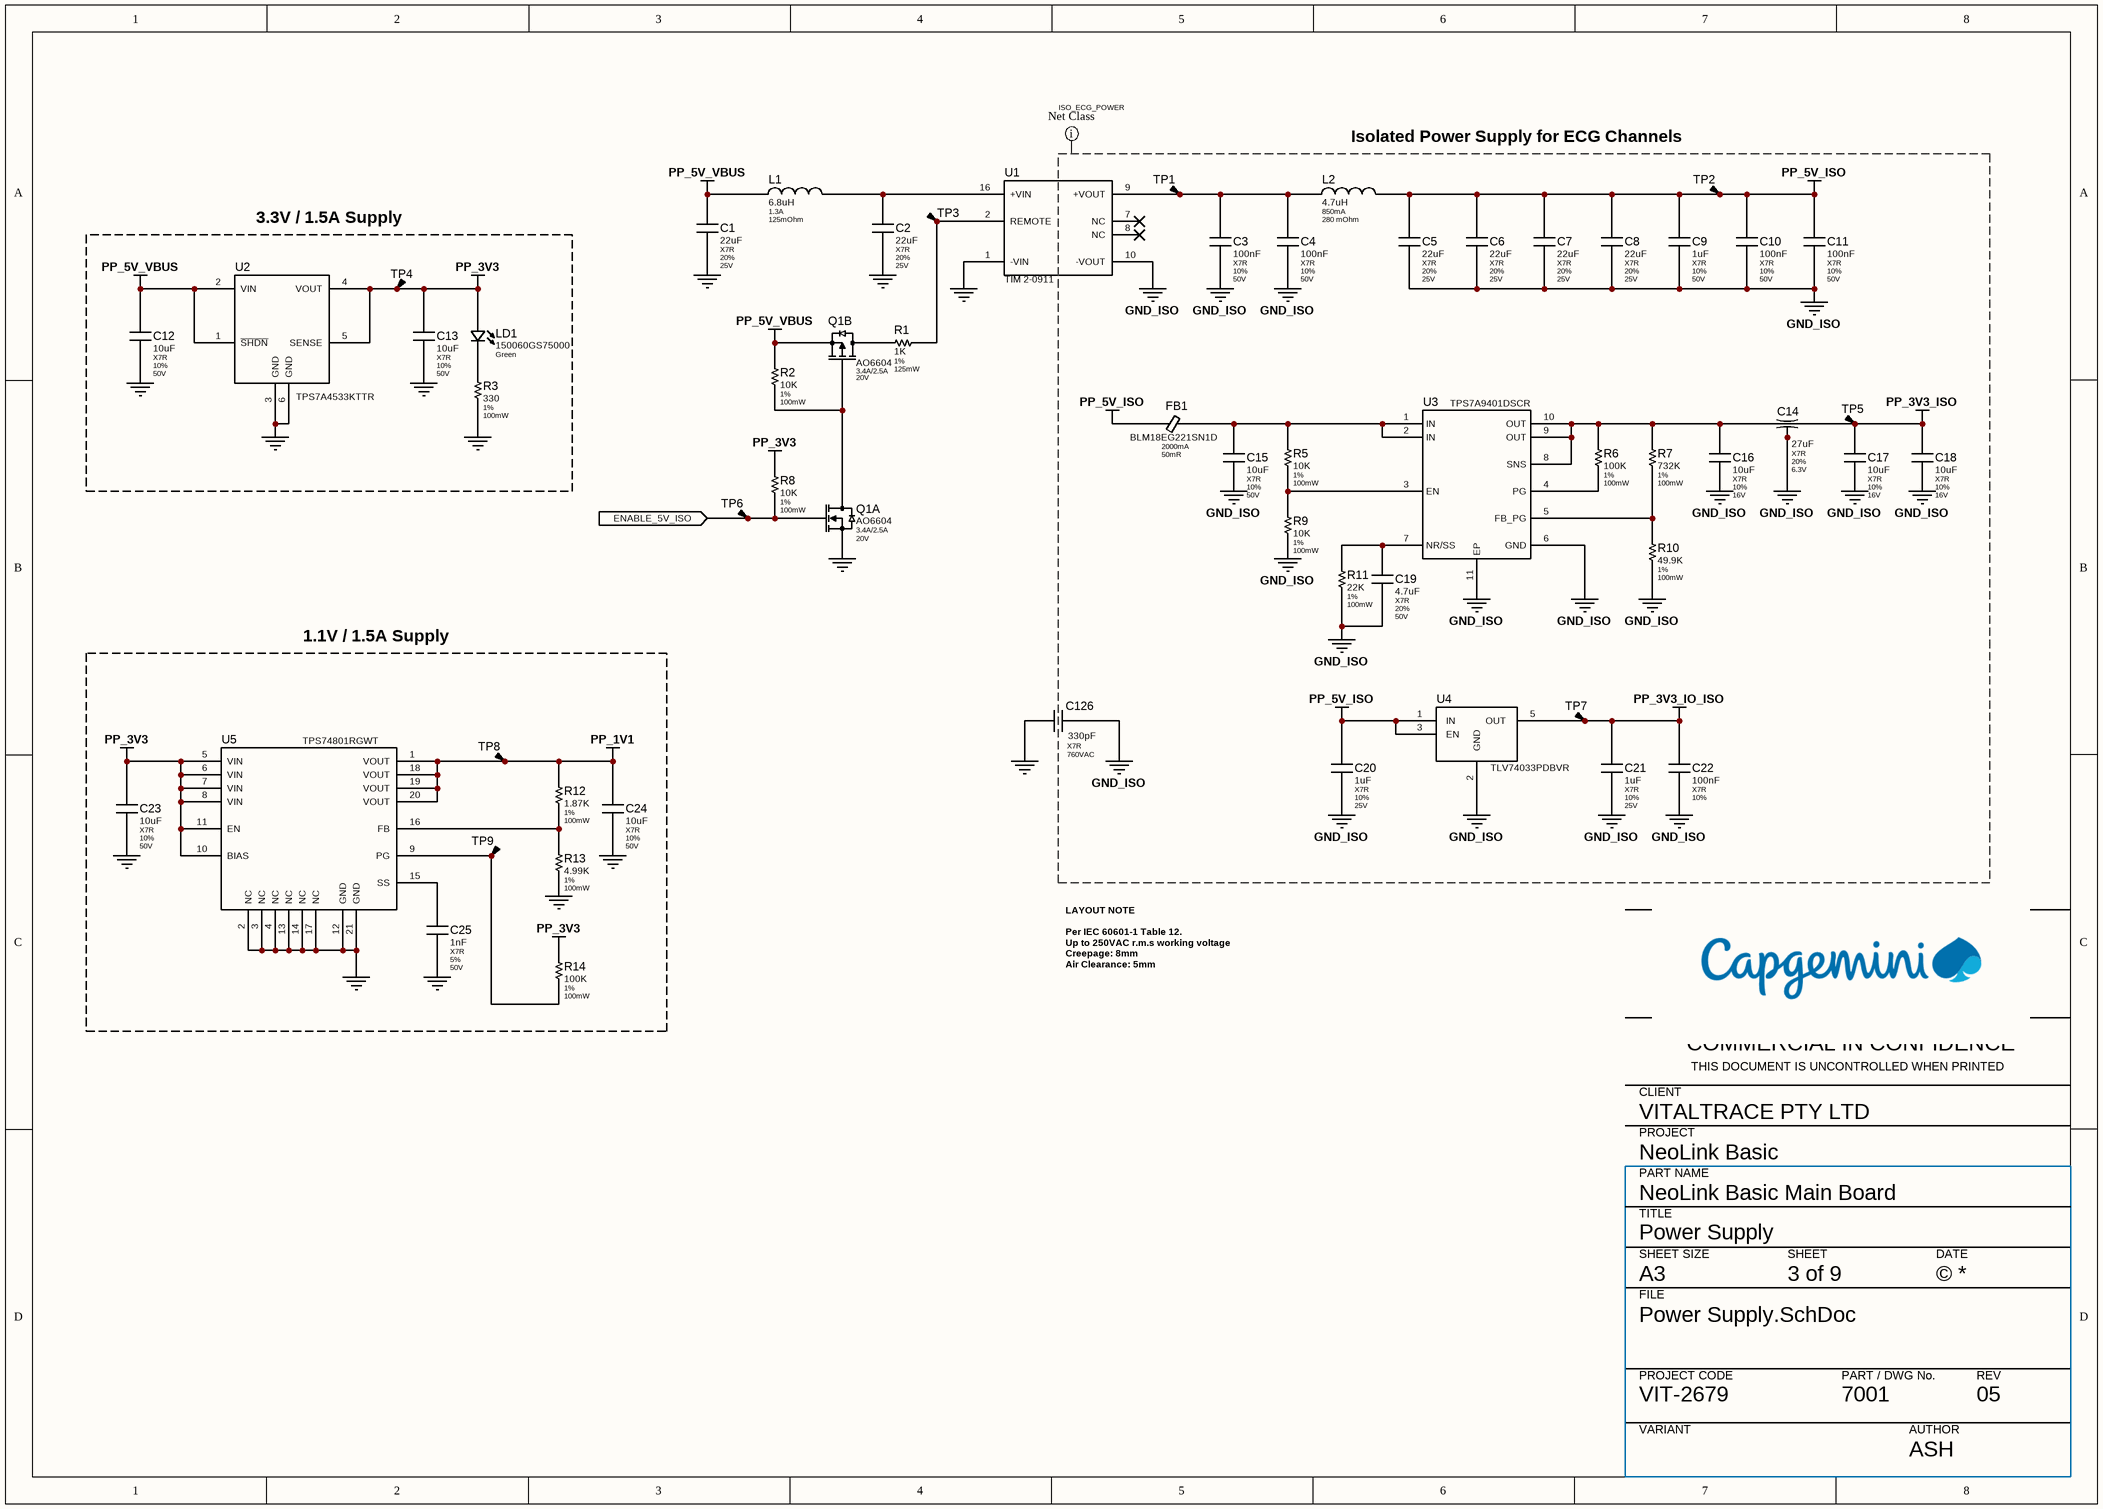
[diagram p3: Power Supply.SchDoc]

### Parts
C1  22uF  Dielectric: X7R  Tolerance: 20%  Voltage: 25V  [MLCC-1210-N]
C2  22uF  Dielectric: X7R  Tolerance: 20%  Voltage: 25V  [MLCC-1210-N]
C3  100nF  Dielectric: X7R  Tolerance: 10%  Voltage: 50V  [MLCC-0402-N]
C4  100nF  Dielectric: X7R  Tolerance: 10%  Voltage: 50V  [MLCC-0402-N]
C5  22uF  Dielectric: X7R  Tolerance: 20%  Voltage: 25V  [MLCC-1210-N]
C6  22uF  Dielectric: X7R  Tolerance: 20%  Voltage: 25V  [MLCC-1210-N]
C7  22uF  Dielectric: X7R  Tolerance: 20%  Voltage: 25V  [MLCC-1210-N]
C8  22uF  Dielectric: X7R  Tolerance: 20%  Voltage: 25V  [MLCC-1210-N]
C9  1uF  Dielectric: X7R  Tolerance: 10%  Voltage: 50V  [MLCC-0805-N]
C10  100nF  Dielectric: X7R  Tolerance: 10%  Voltage: 50V  [MLCC-0402-N]
C11  100nF  Dielectric: X7R  Tolerance: 10%  Voltage: 50V  [MLCC-0402-N]
C12  10uF  Dielectric: X7R  Tolerance: 10%  Voltage: 50V  [MLCC-1206-N]
C13  10uF  Dielectric: X7R  Tolerance: 10%  Voltage: 50V  [MLCC-1206-N]
C14  27uF  Dielectric: X7R  Tolerance: 20%  Voltage: 6.3V  [FEEDTHROUGH-1206]
C15  10uF  Dielectric: X7R  Tolerance: 10%  Voltage: 50V  [MLCC-1206-N]
C16  10uF  Dielectric: X7R  Tolerance: 10%  Voltage: 16V  [MLCC-0805-N]
C17  10uF  Dielectric: X7R  Tolerance: 10%  Voltage: 16V  [MLCC-0805-N]
C18  10uF  Dielectric: X7R  Tolerance: 10%  Voltage: 16V  [MLCC-0805-N]
C19  4.7uF  Dielectric: X7R  Tolerance: 20%  Voltage: 50V  [MLCC-0805-N]
C20  1uF  Dielectric: X7R  Tolerance: 10%  Voltage: 25V  [MLCC-0603-N]
C21  1uF  Dielectric: X7R  Tolerance: 10%  Voltage: 25V  [MLCC-0603-N]
C22  100nF  Dielectric: X7R  Tolerance: 10%  [MLCC-0402-N]
C23  10uF  Dielectric: X7R  Tolerance: 10%  Voltage: 50V  [MLCC-1206-N]
C24  10uF  Dielectric: X7R  Tolerance: 10%  Voltage: 50V  [MLCC-1206-N]
C25  1nF  Dielectric: X7R  Tolerance: 5%  Voltage: 50V  [MLCC-0402-N]
C126  330pF  Dielectric: X7R  Voltage: 760VAC  [CAP-RD-8.4x9.5x11.6]
FB1  BLM18EG221SN1D  Current: 2000mA  ESR: 50mR  [FB-0603-N]
L1  6.8uH  Current: 1.3A  ESR: 125mOhm  [78408053006]
L2  4.7uH  Current: 850mA  ESR: 280 mOhm  [LQW32-1210]
LD1  150060GS75000  Colour: Green  [LED-0603-GREEN]
Q1  AO6604  Current: 3.4A/2.5A  Voltage: 20V  [JEDEC-SOT-23-6-N]  (parts A,B of 2)
R1  1K  Tolerance: 1%  Power: 125mW  [RES-0805-N]
R2  10K  Tolerance: 1%  Power: 100mW  [RES-0402-N]
R3  330  Tolerance: 1%  Power: 100mW  [RES-0402-N]
R5  10K  Tolerance: 1%  Power: 100mW  [RES-0402-N]
R6  100K  Tolerance: 1%  Power: 100mW  [RES-0402-N]
R7  732K  Tolerance: 1%  Power: 100mW  [RES-0402-N]
R8  10K  Tolerance: 1%  Power: 100mW  [RES-0402-N]
R9  10K  Tolerance: 1%  Power: 100mW  [RES-0402-N]
R10  49.9K  Tolerance: 1%  Power: 100mW  [RES-0402-N]
R11  22K  Tolerance: 1%  Power: 100mW  [RES-0603-N]
R12  1.87K  Tolerance: 1%  Power: 100mW  [RES-0402-N]
R13  4.99K  Tolerance: 1%  Power: 100mW  [RES-0402-N]
R14  100K  Tolerance: 1%  Power: 100mW  [RES-0402-N]
TP1  TP-SMT-CIRCLE  [TP-1.0mm]  (value not drawn)  (no BOM)
TP2  TP-SMT-CIRCLE  [TP-1.0mm]  (value not drawn)  (no BOM)
TP3  TP-SMT-CIRCLE  [TP-1.0mm]  (value not drawn)  (no BOM)
TP4  TP-SMT-CIRCLE  [TP-1.0mm]  (value not drawn)  (no BOM)
TP5  TP-SMT-CIRCLE  [TP-1.0mm]  (value not drawn)  (no BOM)
TP6  TP-SMT-CIRCLE  [TP-1.0mm]  (value not drawn)  (no BOM)
TP7  TP-SMT-CIRCLE  [TP-1.0mm]  (value not drawn)  (no BOM)
TP8  TP-SMT-CIRCLE  [TP-1.0mm]  (value not drawn)  (no BOM)
TP9  TP-SMT-CIRCLE  [TP-1.0mm]  (value not drawn)  (no BOM)
U1  TIM 2-0911  [TIM 2-0911]
U2  TPS7A4533KTTR  [KTT0005A]
U3  TPS7A9401DSCR  [FP-DSC0010J-MFG]
U4  TLV74033PDBVR  [SOT-23-5-N]
U5  TPS74801RGWT  [RGW0020A_V]

### Blocks framed on the sheet
3.3V / 1.5A Supply: C12 C13 LD1 R3 TP4 U2
1.1V / 1.5A Supply: C23-C25 R12-R14 TP8 TP9 U5

### Ports
ENABLE_5V_ISO (in)

### Nets
GND: C1.2 C2.2 C12.2 C13.2 C23.2 C24.2 C25.2 C126.1 Q1.S1 R3.2 R13.2 U1.1(-VIN) U2.3(GND) U2.6(GND) U5.2(NC) U5.3(NC) U5.4(NC) U5.12(GND) U5.13(NC) U5.14(NC) U5.17(NC) U5.21(GND)
GND_ISO: C3.2 C4.2 C5.2 C6.2 C7.2 C8.2 C9.2 C10.2 C11.2 C14.2 C14.4 C15.2 C16.2 C17.2 C18.2 C19.2 C20.2 C21.2 C22.2 C126.2 R9.2 R10.2 R11.2 U1.10(-VOUT) U3.6(GND) U3.11(EP) U4.2(GND)
PP_1V1: C24.1 R12.1 TP8.1 U5.1(VOUT) U5.18(VOUT) U5.19(VOUT) U5.20(VOUT)
PP_3V3: C13.1 C23.1 LD1.A R8.1 R14.1 TP4.1 U2.4(VOUT) U2.5(SENSE) U5.5(VIN) U5.6(VIN) U5.7(VIN) U5.8(VIN) U5.10(BIAS) U5.11(EN)
PP_3V3_IO_ISO: C21.1 C22.1 TP7.1 U4.5(OUT)
PP_3V3_ISO: C14.3 C17.1 C18.1 TP5.1
PP_5V_ISO: C5.1 C6.1 C7.1 C8.1 C9.1 C10.1 C11.1 C20.1 FB1.1 L2.2 TP2.1 U4.1(IN) U4.3(EN)
PP_5V_VBUS: C1.1 C12.1 L1.1 Q1.S2 R2.1 U2.1(~{SHDN}) U2.2(VIN)
ENABLE_5V_ISO: Q1.G1 R8.2 TP6.1 ; port ENABLE_5V_ISO
NetC2_1: C2.1 L1.2 U1.16(+VIN)
NetC3_1: C3.1 C4.1 L2.1 TP1.1 U1.9(+VOUT)
NetC14_1: C14.1 C16.1 R6.1 R7.1 U3.8(SNS) U3.9(OUT) U3.10(OUT)
NetC15_1: C15.1 FB1.2 R5.1 U3.1(IN) U3.2(IN)
NetC19_1: C19.1 R11.1 U3.7(NR/SS)
NetC25_1: C25.1 U5.15(SS)
NetLD1_K: LD1.K R3.1
NetQ1_D1: Q1.D1 Q1.G2 R2.2
NetQ1_D2: Q1.D2 R1.2
NetR1_1: R1.1 TP3.1 U1.2(REMOTE)
NetR5_2: R5.2 R9.1 U3.3(EN)
NetR6_2: R6.2 U3.4(PG)
NetR7_2: R7.2 R10.1 U3.5(FB_PG)
NetR12_2: R12.2 R13.1 U5.16(FB)
NetR14_2: R14.2 TP9.1 U5.9(PG)

Not connected (* = marked no-connect by the designer): U1 7(NC)* 8(NC)*

### Layout directives
net class ISO_ECG_POWER: GND_ISO, PP_3V3_IO_ISO, PP_3V3_ISO, PP_5V_ISO

### Notes on the sheet
- Isolated Power Supply for ECG Channels
- LAYOUT NOTE
  Per IEC 60601-1 Table 12.
  Up to 250VAC r.m.s working voltage
  Creepage: 8mm
  Air Clearance: 5mm
- COMMERCIAL IN CONFIDENCE
- CLIENT
- THIS DOCUMENT IS UNCONTROLLED WHEN PRINTED
- PROJECT
- PART NAME
- TITLE
- SHEET SIZE
- SHEET
- DATE
- A3
- FILE
- PROJECT CODE
- PART / DWG No.
- REV
- VARIANT
- AUTHOR

### Library data of the parts
C1 C2 C5-C8 = CMP-0000000898-3: CAP-CER-22uF-25V-1210-X7R-20%; Value: 22uF
C3 C4 C10 C11 = CMP-0000000712-3: CAP-CER-100nF-50V-0402-X7R-10%; Value: 100nF
C9 = CMP-0000001064-2: CAP-CER-1uF-50V-0805-X7R-10%; Value: 1uF
C12 C13 C15 C23 C24 = CMP-0000002231-1: CAP-CER-10uF-50V-1206-X7R-10%; Value: 10uF
C14 = CMP-0000003462-3: CAP-FEEDTHROUGH-27uF-6.3V-1206; Value: 27uF
C16-C18 = CMP-0000002045-2: CAP-CER-10uF-16V-0805-X7R-10%; Value: 10uF
C19 = CMP-0000003284-1: CAP-CER-4.7uF-50V-0805-X7R-20%; Value: 4.7uF
C20 C21 = CMP-0000000632-4: CAP-CER-1uF-25V-0603-X7R-10%; Value: 1uF
C22 = CMP-0000000712-3: CAP-CER-100nF-50V-0402-X7R-10%; Voltage: 50V; Value: 100nF
C25 = CMP-0000000732-3: CAP-CER-1nF-50V-0402-X7R-5%; Value: 1nF
C126 = CMP-0000003659-2: CAP-SAFETY-330pF-760VAC-RADIAL-9.5mm; Tolerance: 10%; Value: 330pF; ComponentLink1URL: https://www.vishay.com/docs/23102/440lseries.pdf; ComponentLink1Description: Datasheet
FB1 = CMP-00084-3: as FB2 on sheet USB 2.0 Hub; ComponentLink1Description: Datasheet; Manufacturer Part Number: BLM18EG221SN1D; ComponentLink1URL: https://www.murata.com/en-us/products/productdata/8796747366430/ENFA0021.pdf
L1 = CMP-00288-1: IND-6.8uH-1.3A-125mOhm-20%; Manufacturer: Würth Elektronik; Tolerance: ±20%; ComponentLink1URL: https://www.we-online.com/components/products/datasheet/78408053006.pdf; ComponentLink1Description: Datasheet; Value: 6.8uH; Manufacturer Part Number: 78408053006
L2 = CMP-00289-1: IND-4.7uH-850mA-280mOhm-20%-3.2x2.5x2.5; Manufacturer Part Number: LQW32FT4R7M0HL; Manufacturer: Murata Electronics; Tolerance: 20%; Value: 4.7uH
LD1 = CMP-0000001161-5: LED-GREEN-150060GS75000; Manufacturer: Wurth Elektronik; Forward Current: 20mA; Forward Voltage: 3.2V; ComponentLink1Description: Datasheet; ComponentLink1URL: https://au.mouser.com/datasheet/2/445/150060GS75000-1714120.pdf; Manufacturer Part Number: 150060GS75000
Q1 = CMP-0000001263-4: MOSFET-N/P-20V-3.4A/2.5A-AO6604; pin to pad: D1>6 D2>4 G1>1 G2>3 S1>5 S2>2; Manufacturer: Alpha & Omega; Rds On: 65mR; Type: N and P-Channel Complementary; Manufacturer Part Number: AO6604; Datasheet: http://www.aosmd.com/res/data_sheets/AO6604.pdf; PartId: 1
R1 = CMP-0000002324-2: RES-1K-0805-1%-125mW; Value: 1K
R2 R5 R8 R9 = CMP-0000001609-1: RES-10K-0402-1%-100mW; Value: 10K
R3 = CMP-0000001438-1: RES-330-0402-1%-100mW; Value: 330
R6 R14 = CMP-0000001723-1: RES-100K-0402-1%-100mW; Value: 100K
R7 = CMP-0000001822-1: RES-732K-0402-1%-100mW; Value: 732K
R10 = CMP-0000001688-1: RES-49.9K-0402-1%-100mW; Value: 49.9K
R11 = CMP-0000000378-1: RES-22K-0603-1%-100mW; Value: 22K
R12 = CMP-0000001524-1: RES-1.87K-0402-1%-100mW; Value: 1.87K
R13 = CMP-0000001574-1: RES-4.99K-0402-1%-100mW; Value: 4.99K
TP1-TP9 = CMP-0000000822-22: Test Point, Circular SMT Style
U1 = CMP-0000003483-1: IC-DCDC-ISOLATED-TIM 2-0911; Manufacturer: Traco Power; Manufacturer Part Number: TIM 2-0911; ComponentLink1URL: https://www.tracopower.com/products/tim2.pdf; ComponentLink1Description: Datasheet
U2 = CMP-0000003458-2: IC-LDO-FIXED-3.3V-TPS7A4533KTTR; Manufacturer: Texas Instruments; Voltage - Input (Min): 2.1V; Voltage - Input (Max): 20V; Current - Output 1: 1.5A; Adjustable: No; Voltage - Output 1 (Min/Fixed): 3.3V; ComponentLink1URL: https://www.ti.com/general/docs/suppproductinfo.tsp?distId=10&gotoUrl=http%253A%252F%252Fwww.ti.com%252Flit%252Fgpn%252Ftps7a45; Manufacturer Part Number: TPS7A4533KTTR; ComponentLink1Description: Datasheet
U3 = CMP-0000003461-4: IC-LDO-ADJ-TPS7A9401DSCR; Manufacturer: Texas Instruments; Voltage - Input (Max): 5.7V; Current - Output 1: 1A; Voltage - Output 1 (Max): 5.5V; Voltage - Output 1 (Min/Fixed): 0V; Voltage - Input (Min): 1.7V; Adjustable: Yes; Manufacturer Part Number: TPS7A9401DSCR; ComponentLink1URL: https://www.ti.com/lit/ds/symlink/tps7a94.pdf; ComponentLink1Description: Datasheet
U4 = CMP-0000001050-5: IC-LDO-FIXED-3.3V-TLV74033PDBVR; Manufacturer: Texas Instruments; Voltage - Output 1 (Min/Fixed): 3.3V; Current - Output 1: 300mA; Voltage - Input (Min): 1.4V; Adjustable: No; Voltage - Input (Max): 5.5V; ComponentLink1Description: Datasheet; Manufacturer Part Number: TLV74033PDBVR; ComponentLink1URL: https://www.ti.com/lit/gpn/TLV740P
U5 = CMP-0000003460-3: IC-LDO-ADJ-TPS74801RGWT; Manufacturer: Texas Instruments; Current - Output 1: 1.5A; Voltage - Input (Min): 0.8V; Voltage - Input (Max): 5.5V; Voltage - Output 1 (Max): 3.6V; Adjustable: YES; ComponentLink1Description: Datasheet; ComponentLink1URL: https://www.ti.com/general/docs/suppproductinfo.tsp?distId=10&gotoUrl=https%3A%2F%2Fwww.ti.com%2Flit%2Fgpn%2Ftps74801; Manufacturer Part Number: TPS74801RGWT; Voltage - Output 1 (Min/Fixed): 0.8V

## Sheet USB Ports.SchDoc: USB Ports
size A3; DocumentNumber: 6; SheetNumber: 6; SheetTotal: 9
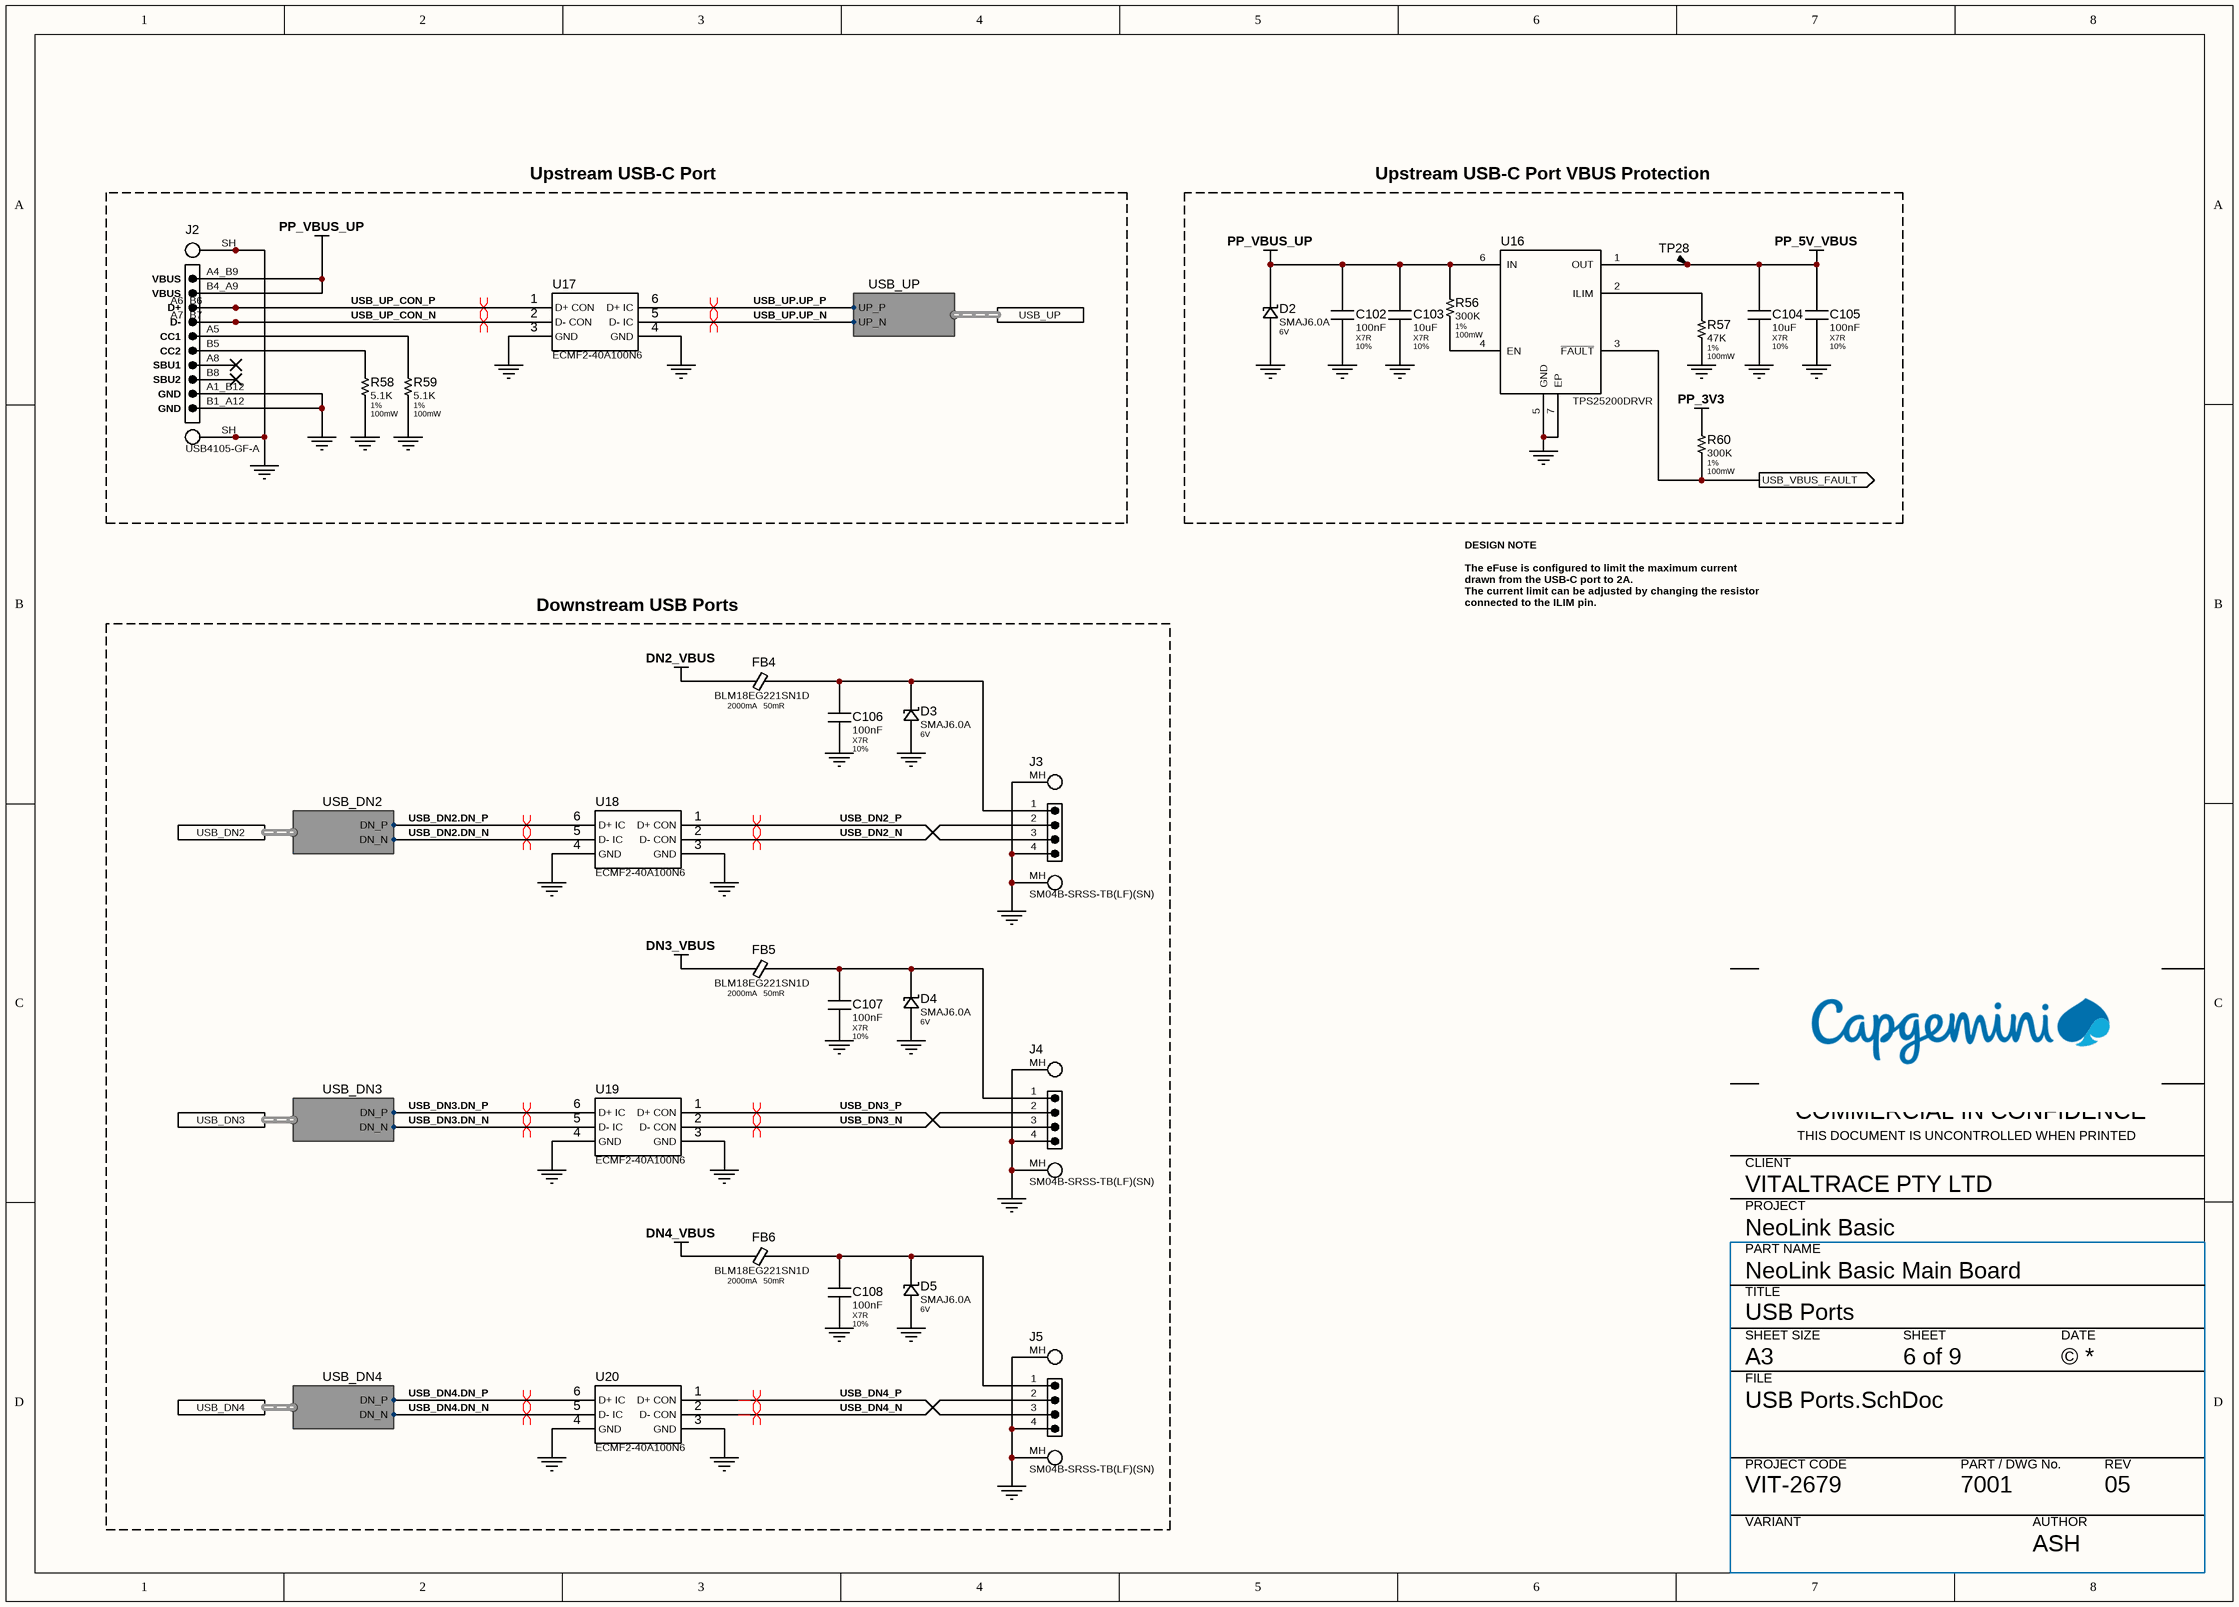
[diagram p4: USB Ports.SchDoc]

### Parts
C102  100nF  Dielectric: X7R  Tolerance: 10%  [MLCC-0402-N]
C103  10uF  Dielectric: X7R  Tolerance: 10%  [MLCC-1206-N]
C104  10uF  Dielectric: X7R  Tolerance: 10%  [MLCC-1206-N]
C105  100nF  Dielectric: X7R  Tolerance: 10%  [MLCC-0402-N]
C106  100nF  Dielectric: X7R  Tolerance: 10%  [MLCC-0402-N]
C107  100nF  Dielectric: X7R  Tolerance: 10%  [MLCC-0402-N]
C108  100nF  Dielectric: X7R  Tolerance: 10%  [MLCC-0402-N]
D2  SMAJ6.0A  Voltage - Reverse: 6V  [JEDEC-DO-214AC-N]
D3  SMAJ6.0A  Voltage - Reverse: 6V  [JEDEC-DO-214AC-N]
D4  SMAJ6.0A  Voltage - Reverse: 6V  [JEDEC-DO-214AC-N]
D5  SMAJ6.0A  Voltage - Reverse: 6V  [JEDEC-DO-214AC-N]
FB4  BLM18EG221SN1D  Current: 2000mA  ESR: 50mR  [FB-0603-N]
FB5  BLM18EG221SN1D  Current: 2000mA  ESR: 50mR  [FB-0603-N]
FB6  BLM18EG221SN1D  Current: 2000mA  ESR: 50mR  [FB-0603-N]
J2  USB4105-GF-A  [GCT USB4105-GF-A]
J3  SM04B-SRSS-TB(LF)(SN)  [SM04B-SRSS-TB(LF)(SN)]
J4  SM04B-SRSS-TB(LF)(SN)  [SM04B-SRSS-TB(LF)(SN)]
J5  SM04B-SRSS-TB(LF)(SN)  [SM04B-SRSS-TB(LF)(SN)]
R56  300K  Tolerance: 1%  Power: 100mW  [RES-0402-N]
R57  47K  Tolerance: 1%  Power: 100mW  [RES-0402-N]
R58  5.1K  Tolerance: 1%  Power: 100mW  [RES-0603-N]
R59  5.1K  Tolerance: 1%  Power: 100mW  [RES-0603-N]
R60  300K  Tolerance: 1%  Power: 100mW  [RES-0402-N]
TP28  TP-SMT-CIRCLE  [TP-1.0mm]  (value not drawn)  (no BOM)
U16  TPS25200DRVR  [SON65P200X200X80-7N]
U17  ECMF2-40A100N6  [ECMF240A100N6]
U18  ECMF2-40A100N6  [ECMF240A100N6]
U19  ECMF2-40A100N6  [ECMF240A100N6]
U20  ECMF2-40A100N6  [ECMF240A100N6]

### Blocks framed on the sheet
Upstream USB-C Port: J2 R58 R59 U17
Upstream USB-C Port VBUS Protection: C102-C105 D2 R56 R57 R60 TP28 U16
Downstream USB Ports: C106-C108 D3-D5 FB4-FB6 J3-J5 U18-U20

### Ports
USB_DN2 (harness USB_DN2), USB_DN3 (harness USB_DN3), USB_DN4 (harness USB_DN4), USB_UP (harness USB_UP), USB_VBUS_FAULT (out)

### Harnesses
USB_DN4: DN_P, DN_N
USB_DN2: DN_P, DN_N
USB_DN3: DN_P, DN_N
USB_UP: UP_P, UP_N

### Nets
DN2_VBUS: FB4.1
DN3_VBUS: FB5.1
DN4_VBUS: FB6.1
GND: C102.2 C103.2 C104.2 C105.2 C106.2 C107.2 C108.2 D2.A D3.A D4.A D5.A J2.A1_B12(GND) J2.B1_A12(GND) J2.SH1 J2.SH2 J2.SH3 J2.SH4 J3.4 J3.MH1(MH) J3.MH2(MH) J4.4 J4.MH1(MH) J4.MH2(MH) J5.4 J5.MH1(MH) J5.MH2(MH) R57.2 R58.2 R59.2 U16.5(GND) U16.7(EP) U17.3(GND) U17.4(GND) U18.3(GND) U18.4(GND) U19.3(GND) U19.4(GND) U20.3(GND) U20.4(GND)
PP_3V3: R60.1
PP_5V_VBUS: C104.1 C105.1 TP28.1 U16.1(OUT)
PP_VBUS_UP: C102.1 C103.1 D2.K J2.A4_B9(VBUS) J2.B4_A9(VBUS) R56.1 U16.6(IN)
USB_DN2.DN_N: U18.5(D-_IC) ; port USB_DN2.DN_N
USB_DN2.DN_P: U18.6(D+_IC) ; port USB_DN2.DN_P
USB_DN2_N: J3.2 U18.2(D-_CON)
USB_DN2_P: J3.3 U18.1(D+_CON)
USB_DN3.DN_N: U19.5(D-_IC) ; port USB_DN3.DN_N
USB_DN3.DN_P: U19.6(D+_IC) ; port USB_DN3.DN_P
USB_DN3_N: J4.2 U19.2(D-_CON)
USB_DN3_P: J4.3 U19.1(D+_CON)
USB_DN4.DN_N: U20.5(D-_IC) ; port USB_DN4.DN_N
USB_DN4.DN_P: U20.6(D+_IC) ; port USB_DN4.DN_P
USB_DN4_N: J5.2 U20.2(D-_CON)
USB_DN4_P: J5.3 U20.1(D+_CON)
USB_UP.UP_N: U17.5(D-_IC) ; port USB_UP.UP_N
USB_UP.UP_P: U17.6(D+_IC) ; port USB_UP.UP_P
USB_UP_CON_N: J2.A7(D-) J2.B7(D-) U17.2(D-_CON)
USB_UP_CON_P: J2.A6(D+) J2.B6(D+) U17.1(D+_CON)
USB_VBUS_FAULT: R60.2 U16.3(~{FAULT}) ; port USB_VBUS_FAULT
NetC106_1: C106.1 D3.K FB4.2 J3.1
NetC107_1: C107.1 D4.K FB5.2 J4.1
NetC108_1: C108.1 D5.K FB6.2 J5.1
NetJ2_A5: J2.A5(CC1) R59.1
NetJ2_B5: J2.B5(CC2) R58.1
NetR56_2: R56.2 U16.4(EN)
NetR57_1: R57.1 U16.2(ILIM)

Not connected (* = marked no-connect by the designer): J2 A8(SBU1)* B8(SBU2)*

### Layout directives
differential pair: USB_DN2.DN_N, USB_DN2.DN_P, USB_DN2_N, USB_DN2_P, USB_DN3.DN_N, USB_DN3.DN_P, USB_DN3_N, USB_DN3_P, USB_DN4.DN_N, USB_DN4.DN_P, USB_DN4_N, USB_DN4_P, USB_UP.UP_N, USB_UP.UP_P, USB_UP_CON_N, USB_UP_CON_P

### Notes on the sheet
- DESIGN NOTE
  The eFuse is configured to limit the maximum current drawn from the USB-C port to 2A.
  The current limit can be adjusted by changing the resistor connected to the ILIM pin.
- COMMERCIAL IN CONFIDENCE
- CLIENT
- THIS DOCUMENT IS UNCONTROLLED WHEN PRINTED
- PROJECT
- PART NAME
- TITLE
- SHEET SIZE
- SHEET
- DATE
- A3
- FILE
- PROJECT CODE
- PART / DWG No.
- REV
- VARIANT
- AUTHOR
- (in symbol CMP-0000002859-3) SH; A6, B6; A7, B7

### Library data of the parts
C102 C105-C108 = CMP-0000000712-3: as C22 on sheet Power Supply; Value: 100nF
C103 C104 = CMP-0000002231-1: CAP-CER-10uF-50V-1206-X7R-10%; Voltage: 50V; Value: 10uF
D2-D5 = CMP-0000002064-3: DIODE-TVS-6V-SMAJ6.0A; Manufacturer Part Number: SMAJ6.0A-13-F; Manufacturer: Diodes Incorporated; Type: TVS; Current: 38.8A; ComponentLink1Description: Datasheet; ComponentLink1URL: https://www.diodes.com/assets/Datasheets/SMAJ5.0CA-SMAJ200CA.pdf
FB4-FB6 = CMP-00084-3: as FB2 on sheet USB 2.0 Hub; ComponentLink1Description: Datasheet; Manufacturer Part Number: BLM18EG221SN1D; ComponentLink1URL: https://www.murata.com/en-us/products/productdata/8796747366430/ENFA0021.pdf
J2 = CMP-0000002859-3: CONN-GCT-USB-C-USB4105-GF-A; Manufacturer: GCT; ComponentLink1Description: Datasheet; Manufacturer Part Number: USB4105-GF-A; Type: USB C; ComponentLink1URL: https://mm.digikey.com/Volume0/opasdata/d220001/medias/docus/5492/USB4105.pdf
J3-J5 = CMP-0000003475-5: CONN-JST-SR/SZ-1x4-SM04B-SRSS-TB(LF)(SN); pin to pad: MH1>5 MH2>6; Manufacturer: JST; ComponentLink1URL: https://au.mouser.com/datasheet/3/1070/1/eSR_SZ.pdf; Manufacturer Part Number: SM04B-SRSS-TB(LF)(SN); Type: Header; ComponentLink1Description: Datasheet
R56 R60 = CMP-0000001775-1: RES-300K-0402-1%-100mW; Value: 300K
R57 = CMP-0000001685-1: RES-47K-0402-1%-100mW; Value: 47K
R58 R59 = CMP-0000000308-1: RES-5.1K-0603-1%-100mW; Value: 5.1K
TP28 = CMP-0000000822-22: Test Point, Circular SMT Style
U16 = CMP-0000003499-1: IC-eFuse-5V-TPS25200DRVR; Manufacturer: Texas Instruments; Manufacturer Part Number: TPS25200DRVR; ComponentLink1URL: https://www.ti.com/general/docs/suppproductinfo.tsp?distId=10&gotoUrl=https%3A%2F%2Fwww.ti.com%2Flit%2Fgpn%2Ftps25200; ComponentLink1Description: Datasheet
U17-U20 = CMP-0000003474-3: IC-USB-CMD-ESD-PROTECT-ECMF2-40A100N6; Manufacturer: STMicroelectronics; Manufacturer Part Number: ECMF2-40A100N6; ComponentLink1Description: Datasheet; ComponentLink1URL: https://www.st.com/resource/en/datasheet/ecmf2-40a100n6.pdf

## Sheet MCU.SchDoc: MCU
size A2; DocumentNumber: 4; SheetNumber: 4; SheetTotal: 9
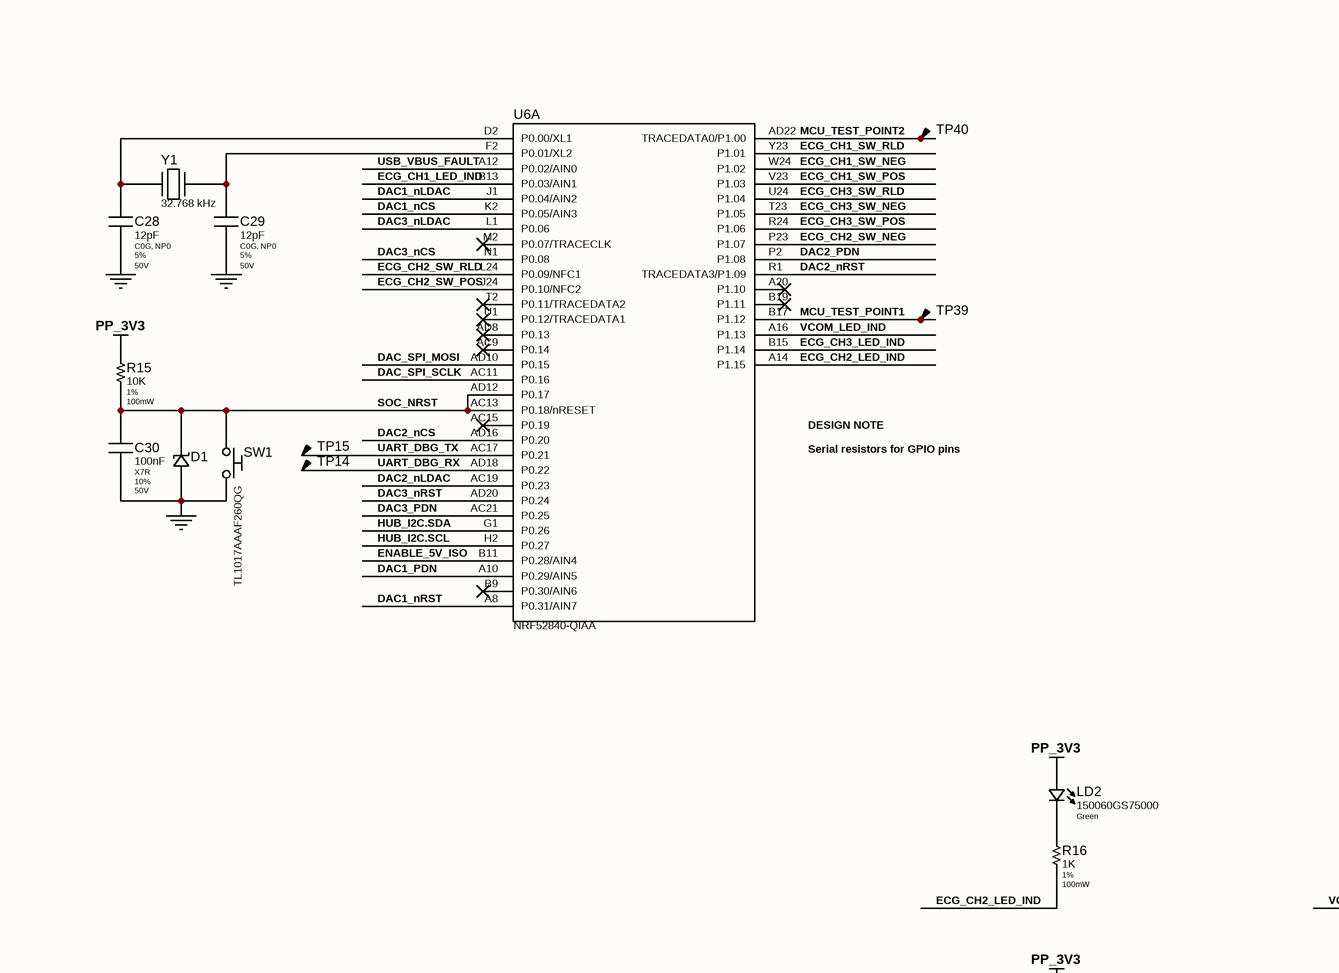
[diagram p5: MCU.SchDoc, top left]
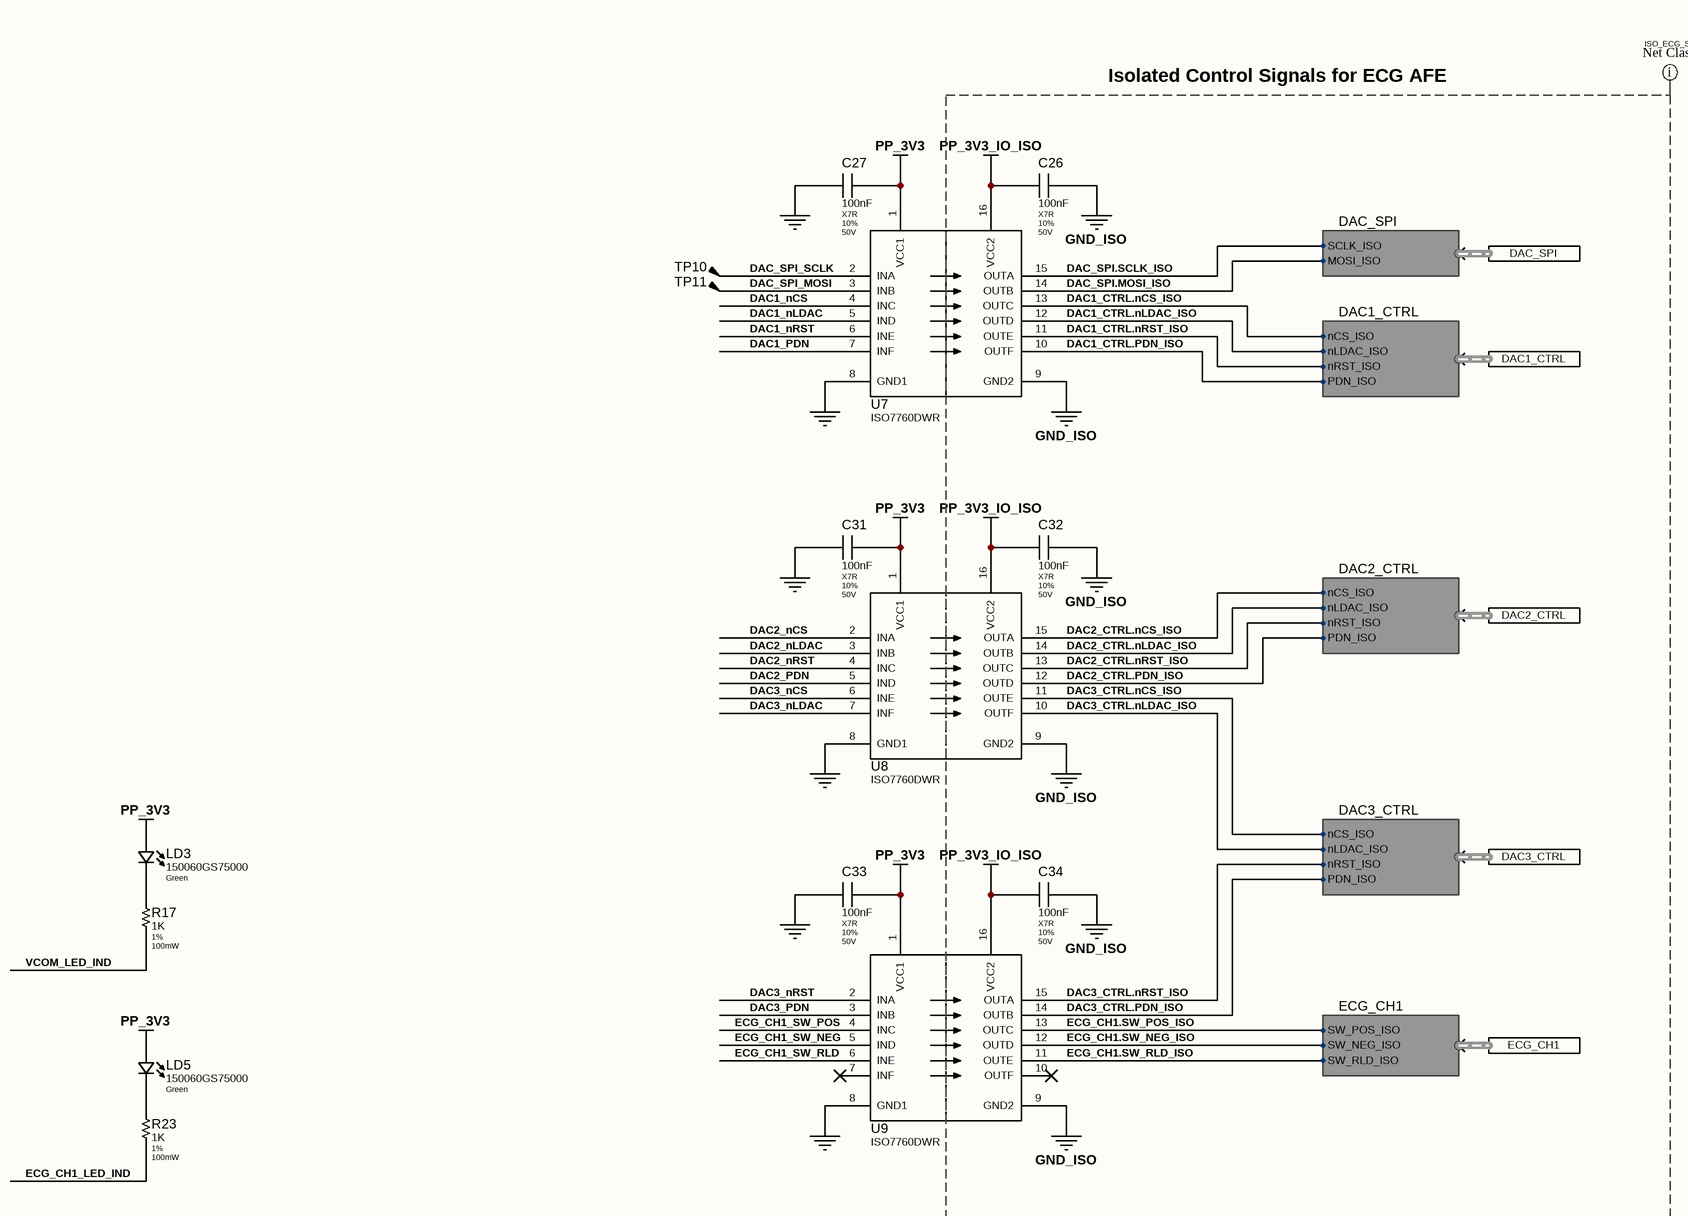
[diagram p6: MCU.SchDoc, top right]
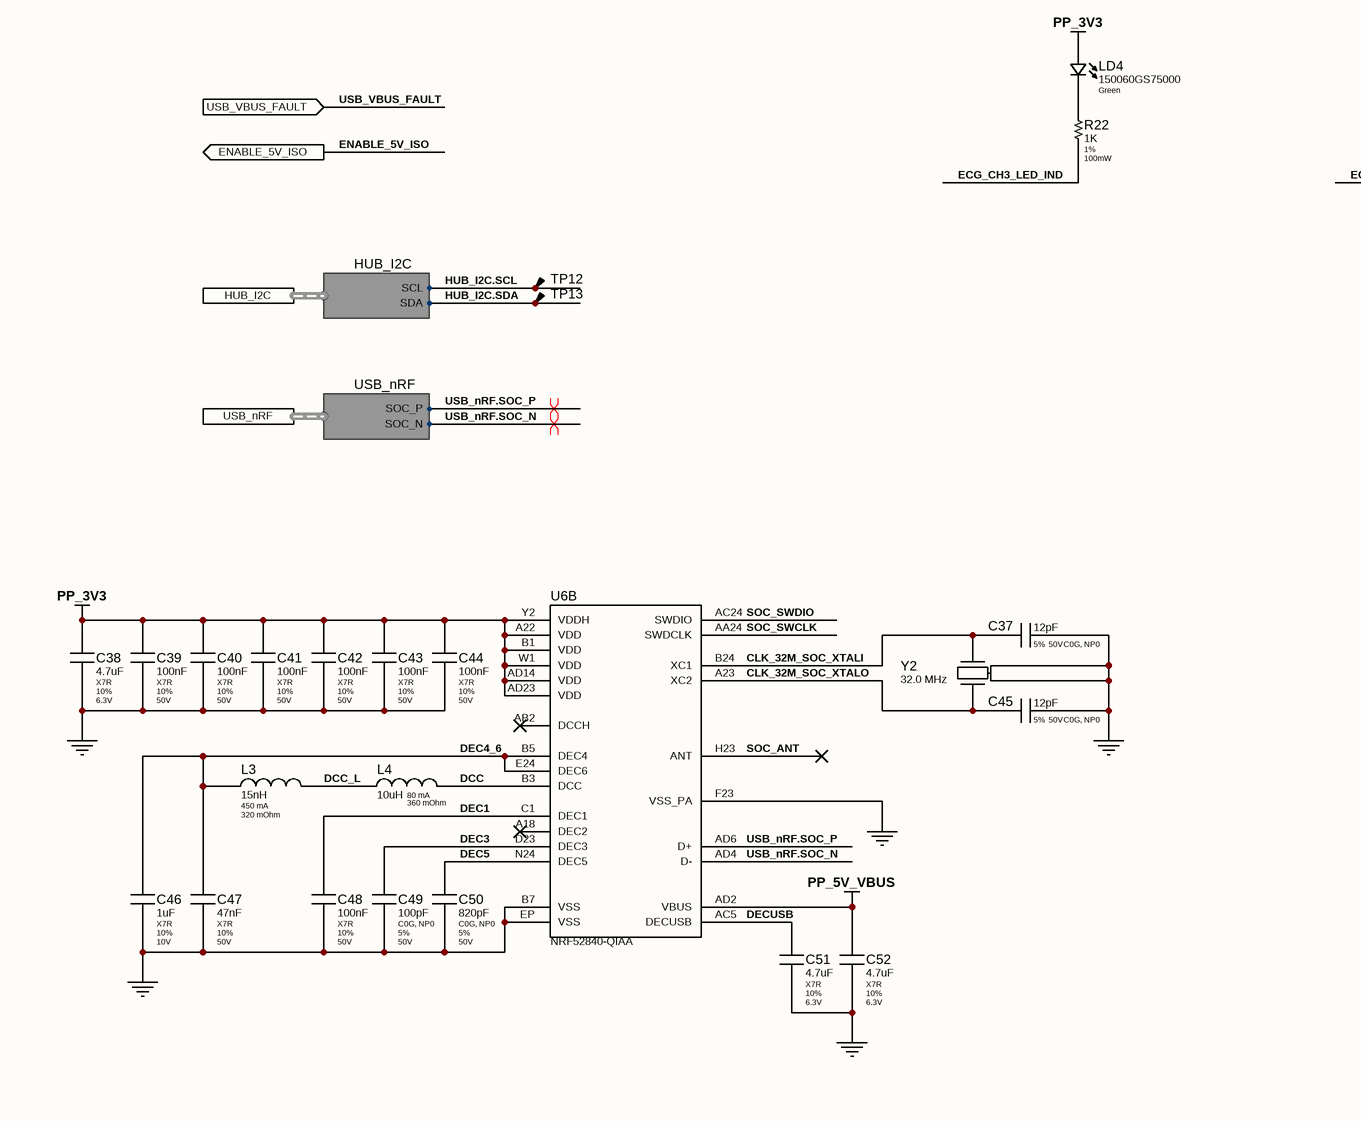
[diagram p7: MCU.SchDoc, bottom left]
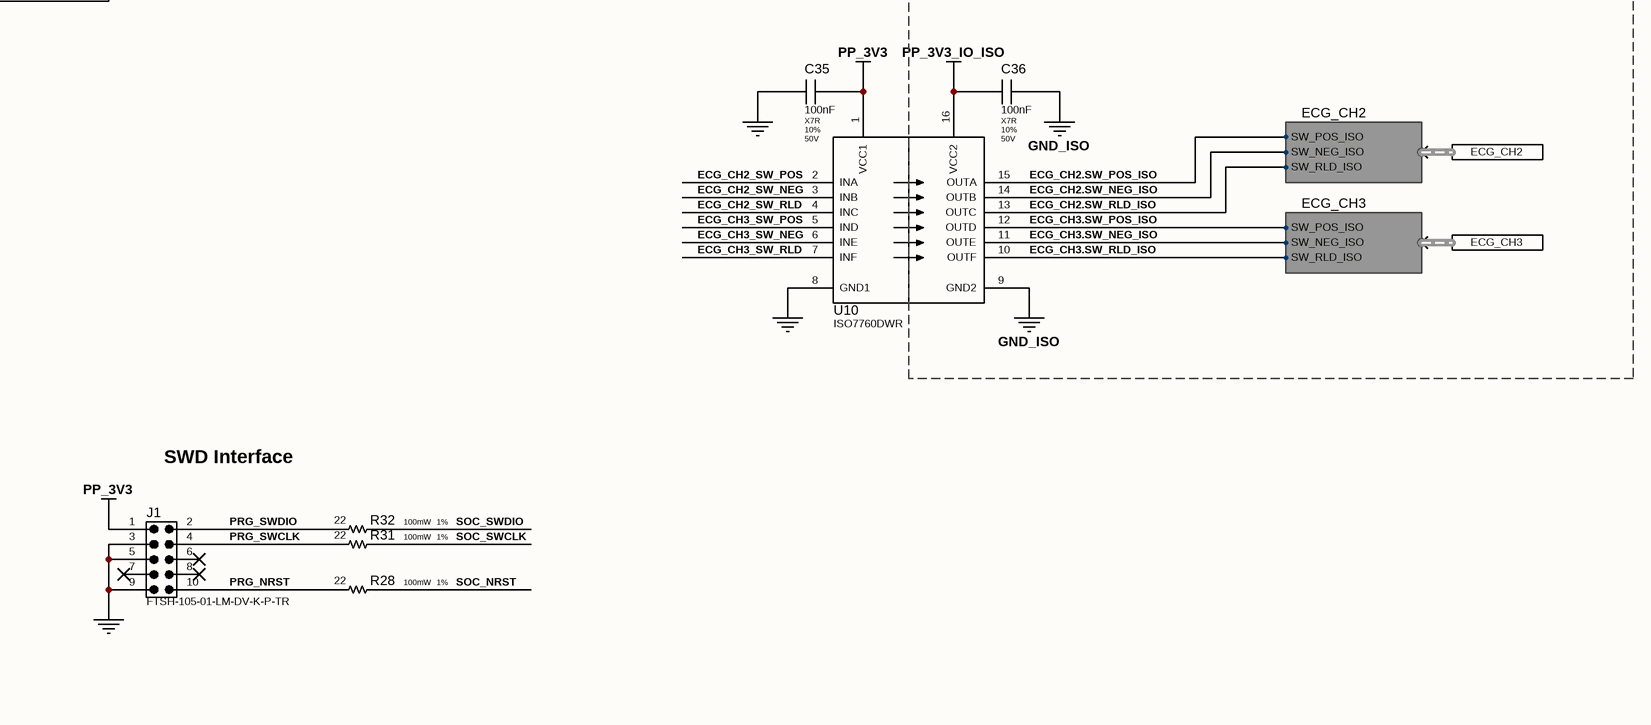
[diagram p8: MCU.SchDoc, bottom right]

### Parts
C26  100nF  Dielectric: X7R  Tolerance: 10%  Voltage: 50V  [MLCC-0402-L]
C27  100nF  Dielectric: X7R  Tolerance: 10%  Voltage: 50V  [MLCC-0402-L]
C28  12pF  Dielectric: C0G, NP0  Tolerance: 5%  Voltage: 50V  [MLCC-0402-N]
C29  12pF  Dielectric: C0G, NP0  Tolerance: 5%  Voltage: 50V  [MLCC-0402-N]
C30  100nF  Dielectric: X7R  Tolerance: 10%  Voltage: 50V  [MLCC-0402-L]
C31  100nF  Dielectric: X7R  Tolerance: 10%  Voltage: 50V  [MLCC-0402-L]
C32  100nF  Dielectric: X7R  Tolerance: 10%  Voltage: 50V  [MLCC-0402-L]
C33  100nF  Dielectric: X7R  Tolerance: 10%  Voltage: 50V  [MLCC-0402-L]
C34  100nF  Dielectric: X7R  Tolerance: 10%  Voltage: 50V  [MLCC-0402-L]
C35  100nF  Dielectric: X7R  Tolerance: 10%  Voltage: 50V  [MLCC-0402-L]
C36  100nF  Dielectric: X7R  Tolerance: 10%  Voltage: 50V  [MLCC-0402-L]
C37  12pF  Dielectric: C0G, NP0  Tolerance: 5%  Voltage: 50V  [MLCC-0402-L]
C38  4.7uF  Dielectric: X7R  Tolerance: 10%  Voltage: 6.3V  [MLCC-0603-L]
C39  100nF  Dielectric: X7R  Tolerance: 10%  Voltage: 50V  [MLCC-0402-L]
C40  100nF  Dielectric: X7R  Tolerance: 10%  Voltage: 50V  [MLCC-0402-L]
C41  100nF  Dielectric: X7R  Tolerance: 10%  Voltage: 50V  [MLCC-0402-L]
C42  100nF  Dielectric: X7R  Tolerance: 10%  Voltage: 50V  [MLCC-0402-L]
C43  100nF  Dielectric: X7R  Tolerance: 10%  Voltage: 50V  [MLCC-0402-L]
C44  100nF  Dielectric: X7R  Tolerance: 10%  Voltage: 50V  [MLCC-0402-L]
C45  12pF  Dielectric: C0G, NP0  Tolerance: 5%  Voltage: 50V  [MLCC-0402-L]
C46  1uF  Dielectric: X7R  Tolerance: 10%  Voltage: 10V  [MLCC-0402-N]
C47  47nF  Dielectric: X7R  Tolerance: 10%  Voltage: 50V  [MLCC-0402-L]
C48  100nF  Dielectric: X7R  Tolerance: 10%  Voltage: 50V  [MLCC-0402-L]
C49  100pF  Dielectric: C0G, NP0  Tolerance: 5%  Voltage: 50V  [MLCC-0402-L]
C50  820pF  Dielectric: C0G, NP0  Tolerance: 5%  Voltage: 50V  [MLCC-0402-L]
C51  4.7uF  Dielectric: X7R  Tolerance: 10%  Voltage: 6.3V  [MLCC-0603-L]
C52  4.7uF  Dielectric: X7R  Tolerance: 10%  Voltage: 6.3V  [MLCC-0603-L]
D1  SZESD9101P2T5G  [SOD-923]  (value not drawn)
J1  FTSH-105-01-LM-DV-K-P-TR  [FTSH-105-01-X-DV-K]
L3  15nH  Current: 450 mA  ESR: 320 mOhm  [FB-0402-L]
L4  10uH  Current: 80 mA  ESR: 360 mOhm  [FB-0603-L]
LD2  150060GS75000  Colour: Green  [LED-0603-GREEN]
LD3  150060GS75000  Colour: Green  [LED-0603-GREEN]
LD4  150060GS75000  Colour: Green  [LED-0603-GREEN]
LD5  150060GS75000  Colour: Green  [LED-0603-GREEN]
R15  10K  Tolerance: 1%  Power: 100mW  [RES-0402-N]
R16  1K  Tolerance: 1%  Power: 100mW  [RES-0402-N]
R17  1K  Tolerance: 1%  Power: 100mW  [RES-0402-N]
R22  1K  Tolerance: 1%  Power: 100mW  [RES-0402-N]
R23  1K  Tolerance: 1%  Power: 100mW  [RES-0402-N]
R28  22  Tolerance: 1%  Power: 100mW  [RES-0402-N]
R31  22  Tolerance: 1%  Power: 100mW  [RES-0402-N]
R32  22  Tolerance: 1%  Power: 100mW  [RES-0402-N]
SW1  TL1017AAAF260QG  [TL1017AAAF260QG]
TP10  TP-SMT-CIRCLE  [TP-0.8mm]  (value not drawn)  (no BOM)
TP11  TP-SMT-CIRCLE  [TP-0.8mm]  (value not drawn)  (no BOM)
TP12  TP-SMT-CIRCLE  [TP-0.8mm]  (value not drawn)  (no BOM)
TP13  TP-SMT-CIRCLE  [TP-0.8mm]  (value not drawn)  (no BOM)
TP14  TP-SMT-CIRCLE  [TP-1.0mm]  (value not drawn)  (no BOM)
TP15  TP-SMT-CIRCLE  [TP-1.0mm]  (value not drawn)  (no BOM)
TP39  TP-SMT-CIRCLE  [TP-0.8mm]  (value not drawn)  (no BOM)
TP40  TP-SMT-CIRCLE  [TP-0.8mm]  (value not drawn)  (no BOM)
U6  NRF52840-QIAA  [NRF52840-QIAA]  (parts A,B of 2)
U7  ISO7760DWR  [TI SOIC-16 ISOLATED]
U8  ISO7760DWR  [TI SOIC-16 ISOLATED]
U9  ISO7760DWR  [TI SOIC-16 ISOLATED]
U10  ISO7760DWR  [TI SOIC-16 ISOLATED]
Y1  32.768 kHz  [XTAL-2.0x1.2]
Y2  32.0 MHz  [XTAL-2.0x1.6]

### Ports
DAC1_CTRL (harness DAC1_CTRL), DAC2_CTRL (harness DAC2_CTRL), DAC3_CTRL (harness DAC3_CTRL), DAC_SPI (harness DAC_SPI), ECG_CH1 (harness ECG_CH1), ECG_CH2 (harness ECG_CH2), ECG_CH3 (harness ECG_CH3), ENABLE_5V_ISO (out), HUB_I2C (harness HUB_I2C), USB_nRF (harness USB_nRF), USB_VBUS_FAULT (in)

### Harnesses
USB_nRF: SOC_P, SOC_N
DAC_SPI: MOSI_ISO, SCLK_ISO
DAC1_CTRL: nLDAC_ISO, nCS_ISO, nRST_ISO, PDN_ISO
DAC2_CTRL: nLDAC_ISO, nCS_ISO, nRST_ISO, PDN_ISO
HUB_I2C: SCL, SDA
ECG_CH2: SW_NEG_ISO, SW_POS_ISO, SW_RLD_ISO
ECG_CH1: SW_NEG_ISO, SW_POS_ISO, SW_RLD_ISO
DAC3_CTRL: nLDAC_ISO, nCS_ISO, nRST_ISO, PDN_ISO
ECG_CH3: SW_NEG_ISO, SW_POS_ISO, SW_RLD_ISO

### Nets
GND: C27.1 C28.2 C29.2 C30.2 C31.1 C33.1 C35.1 C37.2 C38.2 C39.2 C40.2 C41.2 C42.2 C43.2 C44.2 C45.2 C46.2 C47.2 C48.2 C49.2 C50.2 C51.2 C52.2 D1.A J1.3 J1.5 J1.9 SW1.2 U6.B7(VSS) U6.EP(VSS) U6.F23(VSS_PA) U7.8(GND1) U8.8(GND1) U9.8(GND1) U10.8(GND1) Y2.2 Y2.4
GND_ISO: C26.2 C32.2 C34.2 C36.2 U7.9(GND2) U8.9(GND2) U9.9(GND2) U10.9(GND2)
PP_3V3: C27.2 C31.2 C33.2 C35.2 C38.1 C39.1 C40.1 C41.1 C42.1 C43.1 C44.1 J1.1 LD2.A LD3.A LD4.A LD5.A R15.1 U6.A22(VDD) U6.AD14(VDD) U6.AD23(VDD) U6.B1(VDD) U6.W1(VDD) U6.Y2(VDDH) U7.1(VCC1) U8.1(VCC1) U9.1(VCC1) U10.1(VCC1)
PP_3V3_IO_ISO: C26.1 C32.1 C34.1 C36.1 U7.16(VCC2) U8.16(VCC2) U9.16(VCC2) U10.16(VCC2)
PP_5V_VBUS: C52.1 U6.AD2(VBUS)
CLK_32M_SOC_XTALI: C37.1 U6.B24(XC1) Y2.3
CLK_32M_SOC_XTALO: C45.1 U6.A23(XC2) Y2.1
DAC1_CTRL.nCS_ISO: U7.13(OUTC) ; port DAC1_CTRL.nCS_ISO
DAC1_CTRL.nLDAC_ISO: U7.12(OUTD) ; port DAC1_CTRL.nLDAC_ISO
DAC1_CTRL.nRST_ISO: U7.11(OUTE) ; port DAC1_CTRL.nRST_ISO
DAC1_CTRL.PDN_ISO: U7.10(OUTF) ; port DAC1_CTRL.PDN_ISO
DAC1_nCS: U6.K2(P0.05/AIN3) U7.4(INC)
DAC1_nLDAC: U6.J1(P0.04/AIN2) U7.5(IND)
DAC1_nRST: U6.A8(P0.31/AIN7) U7.6(INE)
DAC1_PDN: U6.A10(P0.29/AIN5) U7.7(INF)
DAC2_CTRL.nCS_ISO: U8.15(OUTA) ; port DAC2_CTRL.nCS_ISO
DAC2_CTRL.nLDAC_ISO: U8.14(OUTB) ; port DAC2_CTRL.nLDAC_ISO
DAC2_CTRL.nRST_ISO: U8.13(OUTC) ; port DAC2_CTRL.nRST_ISO
DAC2_CTRL.PDN_ISO: U8.12(OUTD) ; port DAC2_CTRL.PDN_ISO
DAC2_nCS: U6.AD16(P0.20) U8.2(INA)
DAC2_nLDAC: U6.AC19(P0.23) U8.3(INB)
DAC2_nRST: U6.R1(TRACEDATA3/P1.09) U8.4(INC)
DAC2_PDN: U6.P2(P1.08) U8.5(IND)
DAC3_CTRL.nCS_ISO: U8.11(OUTE) ; port DAC3_CTRL.nCS_ISO
DAC3_CTRL.nLDAC_ISO: U8.10(OUTF) ; port DAC3_CTRL.nLDAC_ISO
DAC3_CTRL.nRST_ISO: U9.15(OUTA) ; port DAC3_CTRL.nRST_ISO
DAC3_CTRL.PDN_ISO: U9.14(OUTB) ; port DAC3_CTRL.PDN_ISO
DAC3_nCS: U6.N1(P0.08) U8.6(INE)
DAC3_nLDAC: U6.L1(P0.06) U8.7(INF)
DAC3_nRST: U6.AD20(P0.24) U9.2(INA)
DAC3_PDN: U6.AC21(P0.25) U9.3(INB)
DAC_SPI.MOSI_ISO: U7.14(OUTB) ; port DAC_SPI.MOSI_ISO
DAC_SPI.SCLK_ISO: U7.15(OUTA) ; port DAC_SPI.SCLK_ISO
DAC_SPI_MOSI: TP11.1 U6.AD10(P0.15) U7.3(INB)
DAC_SPI_SCLK: TP10.1 U6.AC11(P0.16) U7.2(INA)
DCC: L4.1 U6.B3(DCC)
DCC_L: L3.2 L4.2
DEC1: C48.1 U6.C1(DEC1)
DEC3: C49.1 U6.D23(DEC3)
DEC4_6: C46.1 C47.1 L3.1 U6.B5(DEC4) U6.E24(DEC6)
DEC5: C50.1 U6.N24(DEC5)
DECUSB: C51.1 U6.AC5(DECUSB)
ECG_CH1.SW_NEG_ISO: U9.12(OUTD) ; port ECG_CH1.SW_NEG_ISO
ECG_CH1.SW_POS_ISO: U9.13(OUTC) ; port ECG_CH1.SW_POS_ISO
ECG_CH1.SW_RLD_ISO: U9.11(OUTE) ; port ECG_CH1.SW_RLD_ISO
ECG_CH1_LED_IND: R23.2 U6.B13(P0.03/AIN1)
ECG_CH1_SW_NEG: U6.W24(P1.02) U9.5(IND)
ECG_CH1_SW_POS: U6.V23(P1.03) U9.4(INC)
ECG_CH1_SW_RLD: U6.Y23(P1.01) U9.6(INE)
ECG_CH2.SW_NEG_ISO: U10.14(OUTB) ; port ECG_CH2.SW_NEG_ISO
ECG_CH2.SW_POS_ISO: U10.15(OUTA) ; port ECG_CH2.SW_POS_ISO
ECG_CH2.SW_RLD_ISO: U10.13(OUTC) ; port ECG_CH2.SW_RLD_ISO
ECG_CH2_LED_IND: R16.2 U6.A14(P1.15)
ECG_CH2_SW_NEG: U6.P23(P1.07) U10.3(INB)
ECG_CH2_SW_POS: U6.J24(P0.10/NFC2) U10.2(INA)
ECG_CH2_SW_RLD: U6.L24(P0.09/NFC1) U10.4(INC)
ECG_CH3.SW_NEG_ISO: U10.11(OUTE) ; port ECG_CH3.SW_NEG_ISO
ECG_CH3.SW_POS_ISO: U10.12(OUTD) ; port ECG_CH3.SW_POS_ISO
ECG_CH3.SW_RLD_ISO: U10.10(OUTF) ; port ECG_CH3.SW_RLD_ISO
ECG_CH3_LED_IND: R22.2 U6.B15(P1.14)
ECG_CH3_SW_NEG: U6.T23(P1.05) U10.6(INE)
ECG_CH3_SW_POS: U6.R24(P1.06) U10.5(IND)
ECG_CH3_SW_RLD: U6.U24(P1.04) U10.7(INF)
ENABLE_5V_ISO: U6.B11(P0.28/AIN4) ; port ENABLE_5V_ISO
HUB_I2C.SCL: TP12.1 U6.H2(P0.27) ; port HUB_I2C.SCL
HUB_I2C.SDA: TP13.1 U6.G1(P0.26) ; port HUB_I2C.SDA
MCU_TEST_POINT1: TP39.1 U6.B17(P1.12)
MCU_TEST_POINT2: TP40.1 U6.AD22(TRACEDATA0/P1.00)
PRG_NRST: J1.10 R28.1
PRG_SWCLK: J1.4 R31.1
PRG_SWDIO: J1.2 R32.1
SOC_ANT: U6.H23(ANT)
SOC_NRST: C30.1 D1.K R15.2 R28.2 SW1.1 U6.AC13(P0.18/nRESET) U6.AD12(P0.17)
SOC_SWCLK: R31.2 U6.AA24(SWDCLK)
SOC_SWDIO: R32.2 U6.AC24(SWDIO)
UART_DBG_RX: TP14.1 U6.AD18(P0.22)
UART_DBG_TX: TP15.1 U6.AC17(P0.21)
USB_nRF.SOC_N: U6.AD4(D-) ; port USB_nRF.SOC_N
USB_nRF.SOC_P: U6.AD6(D+) ; port USB_nRF.SOC_P
USB_VBUS_FAULT: U6.A12(P0.02/AIN0) ; port USB_VBUS_FAULT
VCOM_LED_IND: R17.2 U6.A16(P1.13)
NetC28_1: C28.1 U6.D2(P0.00/XL1) Y1.2
NetC29_1: C29.1 U6.F2(P0.01/XL2) Y1.1
NetLD2_K: LD2.K R16.1
NetLD3_K: LD3.K R17.1
NetLD4_K: LD4.K R22.1
NetLD5_K: LD5.K R23.1

Not connected (* = marked no-connect by the designer): J1 6* 7* 8*; U6 A18(DEC2)* A20(P1.10)* AB2(DCCH)* AC9(P0.14)* AC15(P0.19)* AD8(P0.13)* B9(P0.30/AIN6)* B19(P1.11)* M2(P0.07/TRACECLK)* T2(P0.11/TRACEDATA2)* U1(P0.12/TRACEDATA1)*; U9 7(INF)* 10(OUTF)*

### Layout directives
differential pair: USB_nRF.SOC_N, USB_nRF.SOC_P
net class ISO_ECG_SIGNAL: DAC1_CTRL.nCS_ISO, DAC1_CTRL.nLDAC_ISO, DAC1_CTRL.nRST_ISO, DAC1_CTRL.PDN_ISO, DAC2_CTRL.nCS_ISO, DAC2_CTRL.nLDAC_ISO, DAC2_CTRL.nRST_ISO, DAC2_CTRL.PDN_ISO, DAC3_CTRL.nCS_ISO, DAC3_CTRL.nLDAC_ISO, DAC3_CTRL.nRST_ISO, DAC3_CTRL.PDN_ISO, DAC_SPI.MOSI_ISO, DAC_SPI.SCLK_ISO, ECG_CH1.SW_NEG_ISO, ECG_CH1.SW_POS_ISO, ECG_CH1.SW_RLD_ISO, ECG_CH2.SW_NEG_ISO, ECG_CH2.SW_POS_ISO, ECG_CH2.SW_RLD_ISO, ECG_CH3.SW_NEG_ISO, ECG_CH3.SW_POS_ISO, ECG_CH3.SW_RLD_ISO, GND_ISO, PP_3V3_IO_ISO

### Notes on the sheet
- Isolated Control Signals for ECG AFE
- (near U6) DESIGN NOTE
  Serial resistors for GPIO pins
- SWD Interface
- THIS DOCUMENT IS UNCONTROLLED WHEN PRINTED
- COMMERCIAL IN CONFIDENCE
- CLIENT
- PROJECT
- PART NAME
- TITLE
- SHEET SIZE
- SHEET
- DATE
- A2
- FILE
- PROJECT CODE
- PART / DWG No.
- REV
- VARIANT
- AUTHOR

### Library data of the parts
C26 C27 C30-C36 C39-C44 C48 = CMP-0000000712-3: CAP-CER-100nF-50V-0402-X7R-10%; Value: 100nF
C28 C29 C37 C45 = CMP-0000000721-3: CAP-CER-12pF-50V-0402-NP0-5%; Value: 12pF
C38 C51 C52 = CMP-0000000635-4: CAP-CER-4.7uF-6.3V-0603-X7R-10%; Value: 4.7uF
C46 = CMP-0000002778-1: CAP-CER-1uF-10V-0402-X7R-10%; Value: 1uF
C47 = CMP-0000000775-3: CAP-CER-47nF-50V-0402-X7R-10%; Value: 47nF
C49 = CMP-0000000714-3: CAP-CER-100pF-50V-0402-NP0-5%; Value: 100pF
C50 = CMP-0000000798-3: CAP-CER-820pF-50V-0402-NP0-5%; Value: 820pF
D1 = CMP-0000001898-5: DIODE-TVS-5V-SZESD9101P2T5G; Manufacturer: onsemi; Voltage - Clamping: 7V; Current: 16A; Voltage - Reverse: 5V; Voltage - Breakdown: 5.3V; Type: TVS; Manufacturer Part Number: SZESD9101P2T5G; ComponentLink1URL: https://www.onsemi.com/pdf/datasheet/esd9101-d.pdf; ComponentLink1Description: Datasheet
J1 = CMP-0000001058-3: CONN-SAMTEC-FTSH-2x5-FTSH-105-01-LM-DV-K-P-TR; Manufacturer: Samtec; ComponentLink1Description: Datasheet; Manufacturer Part Number: FTSH-105-01-LM-DV-K-P-TR; ComponentLink1URL: https://suddendocs.samtec.com/prints/ftsh-1xx-xx-xxx-dv-xxx-xxx-x-xx-mkt.pdf
L3 = CMP-00010-1: IND-15nH-450mA-320mOhm-5%-0402; Manufacturer: Murata Electronics; Manufacturer Part Number: LQG15HS15NJ02D; Tolerance: ±5%; Value: 15nH
L4 = CMP-00001-4: IND-10uH-80mA-360mOhm-20%-0603; Manufacturer: Taiyo Yuden; Manufacturer Part Number: LBMF1608T100M; Tolerance: ±20%; Value: 10uH
LD2-LD5 = CMP-0000001161-5: as LD1 on sheet Power Supply; ComponentLink1Description: Datasheet; ComponentLink1URL: https://au.mouser.com/datasheet/2/445/150060GS75000-1714120.pdf; Manufacturer Part Number: 150060GS75000
R15 = CMP-0000001609-1: RES-10K-0402-1%-100mW; Value: 10K
R16 R17 R22 R23 = CMP-0000000864-1: RES-1K-0402-1%-100mW; Value: 1K
R28 R31 R32 = CMP-0000001303-1: RES-22-0402-1%-100mW; Value: 22
SW1 = CMP-0000002876-1: SWITCH-TACTILE-SPST-NO-3mm x 2.5mm-TL1017AAAF260QG; Manufacturer: E-Switch; Datasheet: https://configured-product-images.s3.amazonaws.com/Datasheets/TL1017.pdf; Manufacturer Part Number: TL1017AAAF260QG
TP10-TP15 TP39 TP40 = CMP-0000000822-22: Test Point, Circular SMT Style
U6 = CMP-0000000638-9: IC-RF-NRF52840-QIAA; Manufacturer: Nordic Semiconductor ASA; Manufacturer Part Number: NRF52840-QIAA; ComponentLink1Description: Datasheet; ComponentLink1URL: https://infocenter.nordicsemi.com/pdf/nRF52840_PS_v1.2.pdf
U7-U10 = CMP-0000003489-2: IC-DIGITAL-ISOLATOR-ISO7760DWR; Manufacturer: Texas Instruments; ComponentLink1URL: https://www.ti.com/lit/ds/symlink/iso7760.pdf?ts=1712058534565&ref_url=https%253A%252F%252Fwww.ti.com%252Fsitesearch%252Fen-us%252Fdocs%252Funiversalsearch.tsp%253FlangPref%253Den-US%2526searchTerm%253DISO7760DBQR%2526nr%253D9; Manufacturer Part Number: ISO7760DWR; ComponentLink1Description: Datasheet
Y1 = CMP-00002-2: XTAL-32.768kHz-10ppm-9pF-2.0x1.2; Manufacturer: Würth Elektronik; Manufacturer Part Number: 830062558; Load Capacitance: 9pF; Tolerance: 10ppm; ComponentLink1Description: Datasheet; Value: 32.768 kHz; ComponentLink1URL: https://www.we-online.com/components/products/datasheet/830062558.pdf
Y2 = CMP-00000-5: XTAL-32MHz-10ppm-8pF-2.0x1.6; Manufacturer: Würth Elektronik; Manufacturer Part Number: 830108212909; Stability: ±15ppm; Tolerance: ±10ppm; Load Capacitance: 8pF; Value: 32.0 MHz